# Altium project RK3588底板.PrjPcb (part 3 of 5)

## Sheet 6.音频_FAN_ADC_LED.SchDoc
size 420 x 297 mm; SheetNumber: 6; SheetTotal: 13
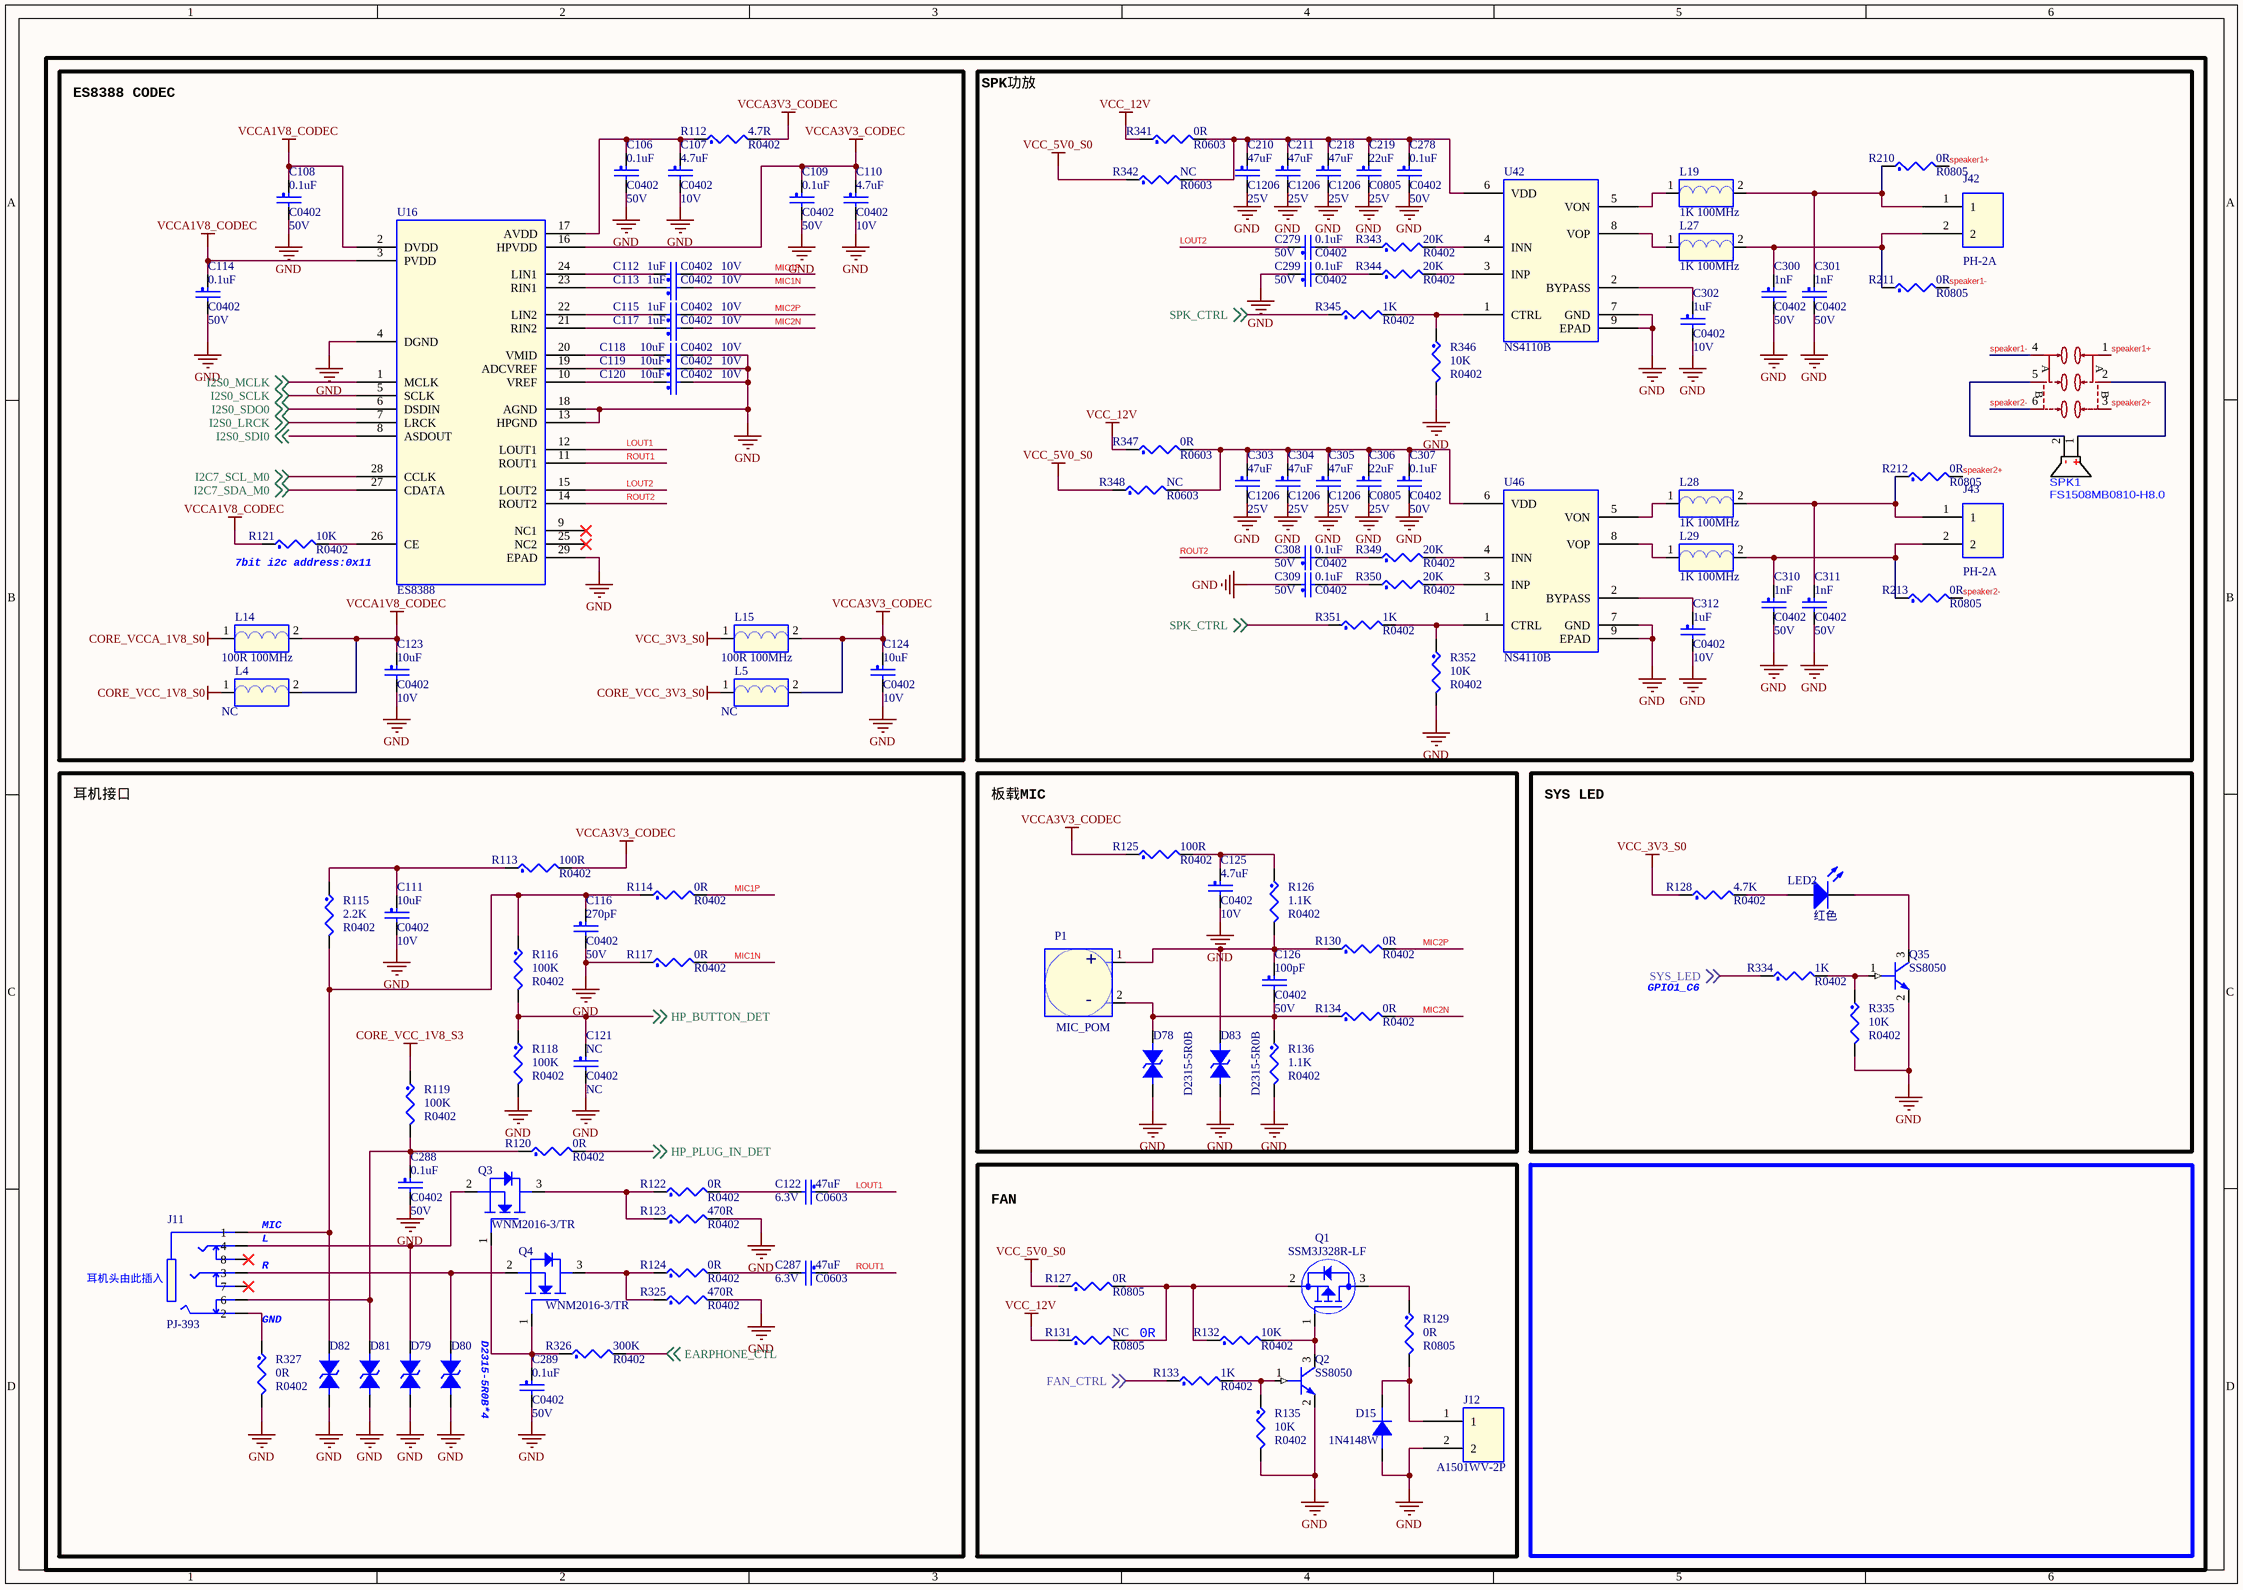
[diagram p5: 6.音频_FAN_ADC_LED.SchDoc]

### Parts
C106  0.1uF  Voltage: 50V  [C0402]
C107  4.7uF  Voltage: 10V  [C0402]
C108  0.1uF  Voltage: 50V  [C0402]
C109  0.1uF  Voltage: 50V  [C0402]
C110  4.7uF  Voltage: 10V  [C0402]
C111  10uF  Voltage: 10V  [C0402]
C112  1uF  Voltage: 10V  [C0402]
C113  1uF  Voltage: 10V  [C0402]
C114  0.1uF  Voltage: 50V  [C0402]
C115  1uF  Voltage: 10V  [C0402]
C116  270pF  Voltage: 50V  [C0402]
C117  1uF  Voltage: 10V  [C0402]
C118  10uF  Voltage: 10V  [C0402]
C119  10uF  Voltage: 10V  [C0402]
C120  10uF  Voltage: 10V  [C0402]
C121  NC  [C0402]
C122  47uF  Voltage: 6.3V  [C0603]
C123  10uF  Voltage: 10V  [C0402]
C124  10uF  Voltage: 10V  [C0402]
C125  4.7uF  Voltage: 10V  [C0402]
C126  100pF  Voltage: 50V  [C0402]
C210  47uF  Voltage: 25V  [C1206]
C211  47uF  Voltage: 25V  [C1206]
C218  47uF  Voltage: 25V  [C1206]
C219  22uF  Voltage: 25V  [C0805]
C278  0.1uF  Voltage: 50V  [C0402]
C279  0.1uF  Voltage: 50V  [C0402]
C287  47uF  Voltage: 6.3V  [C0603]
C288  0.1uF  Voltage: 50V  [C0402]
C289  0.1uF  Voltage: 50V  [C0402]
C299  0.1uF  Voltage: 50V  [C0402]
C300  1nF  Voltage: 50V  [C0402]
C301  1nF  Voltage: 50V  [C0402]
C302  1uF  Voltage: 10V  [C0402]
C303  47uF  Voltage: 25V  [C1206]
C304  47uF  Voltage: 25V  [C1206]
C305  47uF  Voltage: 25V  [C1206]
C306  22uF  Voltage: 25V  [C0805]
C307  0.1uF  Voltage: 50V  [C0402]
C308  0.1uF  Voltage: 50V  [C0402]
C309  0.1uF  Voltage: 50V  [C0402]
C310  1nF  Voltage: 50V  [C0402]
C311  1nF  Voltage: 50V  [C0402]
C312  1uF  Voltage: 10V  [C0402]
D15  1N4148W  [SOD-123]
D78  D2315-5R0B  [esd0402]
D79  D2315-5R0B  [esd0402]  (value not drawn)
D80  D2315-5R0B  [esd0402]  (value not drawn)
D81  D2315-5R0B  [esd0402]  (value not drawn)
D82  D2315-5R0B  [esd0402]  (value not drawn)
D83  D2315-5R0B  [esd0402]
J11  PJ-393  [audio_smd_7p_6r0x8r8]
J12  A1501WV-2P  [zh1p5mm_th_2p]
J42  PH-2A  [PH-1x2-2P0_l]
J43  PH-2A  [PH-1x2-2P0_l]
L4  NC  [L0603]
L5  NC  [L0603]
L14  100R 100MHz  [L0603]
L15  100R 100MHz  [L0603]
L19  1K 100MHz  [L0603]
L27  1K 100MHz  [L0603]
L28  1K 100MHz  [L0603]
L29  1K 100MHz  [L0603]
LED2  红色  [LED0603_R]
P1  MIC_POM  [MIC2-4R00-TM]
Q1  SSM3J328R-LF  [SOT23]
Q2  SS8050  [SOT23]
Q3  WNM2016-3/TR  [SOT23]
Q4  WNM2016-3/TR  [SOT23]
Q35  SS8050  [SOT23]
R112  4.7R  [R0402]
R113  100R  [R0402]
R114  0R  [R0402]
R115  2.2K  [R0402]
R116  100K  [R0402]
R117  0R  [R0402]
R118  100K  [R0402]
R119  100K  [R0402]
R120  0R  [R0402]
R121  10K  [R0402]
R122  0R  [R0402]
R123  470R  [R0402]
R124  0R  [R0402]
R125  100R  [R0402]
R126  1.1K  [R0402]
R127  0R  [R0805]
R128  4.7K  [R0402]
R129  0R  [R0805]
R130  0R  [R0402]
R131  NC  [R0805]
R132  10K  [R0402]
R133  1K  [R0402]
R134  0R  [R0402]
R135  10K  [R0402]
R136  1.1K  [R0402]
R210  0R  [R0805]
R211  0R  [R0805]
R212  0R  [R0805]
R213  0R  [R0805]
R325  470R  [R0402]
R326  300K  [R0402]
R327  0R  [R0402]
R334  1K  [R0402]
R335  10K  [R0402]
R341  0R  [R0603]
R342  NC  [R0603]
R343  20K  [R0402]
R344  20K  [R0402]
R345  1K  [R0402]
R346  10K  [R0402]
R347  0R  [R0603]
R348  NC  [R0603]
R349  20K  [R0402]
R350  20K  [R0402]
R351  1K  [R0402]
R352  10K  [R0402]
SPK1  FS1508MB0810-H8.0  [BEEP-TH_BD15.0-P10.20-D1.2]
SW5  MST22D18G2  [SW-SMD_MST22D18G2]  (value not drawn)
U16  ES8388  [qfn28_0r45-4x4EP2R6X2R6]
U42  NS4110B  [SOP-8-EP-2R5X3R4]
U46  NS4110B  [SOP-8-EP-2R5X3R4]

### Blocks framed on the sheet
ES8388 CODEC: C106-C110 C112-C115 C117-C120 C123 C124 L4 L5 L14 L15 R112 R121 U16
SPK功放: C210 C211 C218 C219 C278 C279 C299-C312 J42 J43 L19 L27-L29 R210-R213 R341-R352 SPK1 SW5 U42 U46
耳机接口: C111 C116 C121 C122 C287-C289 D79-D82 J11 Q3 Q4 R113-R120 R122-R124 R325-R327
板载MIC: C125 C126 D78 D83 P1 R125 R126 R130 R134 R136
SYS LED: LED2 Q35 R128 R334 R335
FAN: D15 J12 Q1 Q2 R127 R129 R131-R133 R135

### Nets
CORE_VCC_1V8_S0: L4.1
CORE_VCC_1V8_S3: R119.1
CORE_VCC_3V3_S0: L5.1
CORE_VCCA_1V8_S0: L14.1
GND: C106.2 C107.2 C108.2 C109.2 C110.2 C111.2 C114.2 C116.2 C118.2 C119.2 C120.2 C121.2 C123.2 C124.2 C125.2 C210.2 C211.2 C218.2 C219.2 C278.2 C288.2 C289.2 C299.1 C300.2 C301.2 C302.2 C303.2 C304.2 C305.2 C306.2 C307.2 C309.1 C310.2 C311.2 C312.2 D15.2(A) D78.1 D79.1 D80.1 D81.1 D82.1 D83.1 J12.2 Q2.2(EMITTER) Q35.2(EMITTER) R117.1 R118.2 R123.2 R135.2 R136.2 R325.2 R327.2 R335.2 R346.2 R352.2 U16.4(DGND) U16.13(HPGND) U16.18(AGND) U16.29(EPAD) U42.7(GND) U42.9(EPAD) U46.7(GND) U46.9(EPAD)
VCC_3V3_S0: L15.1 R128.1
VCC_5V0_S0: R127.1 R342.1 R348.1
VCC_12V: R131.1 R341.1 R347.1
VCCA1V8_CODEC: C108.1 C114.1 C123.1 L4.2 L14.2 R121.1 U16.2(DVDD) U16.3(PVDD)
VCCA3V3_CODEC: C109.1 C110.1 C124.1 L5.2 L15.2 R112.2 R113.2 R125.1 U16.16(HPVDD)
EARPHONE_CTL: R326.2 ; off-sheet EARPHONE_CTL
FAN_CTRL: R133.1 ; off-sheet FAN_CTRL
HP_BUTTON_DET: C121.1 R116.2 R118.1 ; off-sheet HP_BUTTON_DET
HP_PLUG_IN_DET: R120.2 ; off-sheet HP_PLUG_IN_DET  [project net GPIO0_A0]
I2C7_SCL_M0: U16.28(CCLK) ; off-sheet I2C7_SCL_M0
I2C7_SDA_M0: U16.27(CDATA) ; off-sheet I2C7_SDA_M0
I2S0_LRCK: U16.7(LRCK) ; off-sheet I2S0_LRCK
I2S0_MCLK: U16.1(MCLK) ; off-sheet I2S0_MCLK
I2S0_SCLK: U16.5(SCLK) ; off-sheet I2S0_SCLK
I2S0_SDI0: U16.8(ASDOUT) ; off-sheet I2S0_SDI0
I2S0_SDO0: U16.6(DSDIN) ; off-sheet I2S0_SDO0
LOUT1: C122.1 U16.12(LOUT1)
LOUT2: C279.1 U16.15(LOUT2)
MIC1N: C113.2 R117.2
MIC1P: C112.2 R114.2
MIC2N: C117.2 R134.2
MIC2P: C115.2 R130.2
ROUT1: C287.1 U16.11(ROUT1)
ROUT2: C308.1 U16.14(ROUT2)
speaker1+: R210.2 SW5.1
speaker1-: R211.2 SW5.4
speaker2+: R212.2 SW5.3
speaker2-: R213.2 SW5.6
SPK_CTRL: R345.1 R351.1 ; off-sheet SPK_CTRL  [project net GPIO3_D5]
SYS_LED: R334.1 ; off-sheet SYS_LED  [project net GPIO1_C6]
NetC106_1: C106.1 C107.1 R112.1 U16.17(AVDD)
NetC111_1: C111.1 R113.1 R115.1
NetC112_1: C112.1 U16.24(LIN1)
NetC113_1: C113.1 U16.23(RIN1)
NetC115_1: C115.1 U16.22(LIN2)
NetC116_1: C116.1 D82.2 J11.1 R114.1 R115.2 R116.1
NetC117_1: C117.1 U16.21(RIN2)
NetC118_1: C118.1 U16.20(VMID)
NetC119_1: C119.1 U16.19(ADCVREF)
NetC120_1: C120.1 U16.10(VREF)
NetC122_2: C122.2 R122.2
NetC125_1: C125.1 R125.2 R126.1
NetC126_1: C126.1 D83.2 P1.1(Out) R126.2 R130.1
NetC126_2: C126.2 D78.2 P1.2(GND) R134.1 R136.1
NetC210_1: C210.1 C211.1 C218.1 C219.1 C278.1 R341.2 R342.2 U42.6(VDD)
NetC279_2: C279.2 R343.1
NetC287_2: C287.2 R124.2
NetC288_1: C288.1 D81.2 J11.6 R119.2 R120.1
NetC289_1: C289.1 Q3.1(GATE) Q4.1(GATE) R326.1
NetC299_2: C299.2 R344.1
NetC300_1: C300.1 J42.2 L27.2 R211.1
NetC301_1: C301.1 J42.1 L19.2 R210.1
NetC302_1: C302.1 U42.2(BYPASS)
NetC303_1: C303.1 C304.1 C305.1 C306.1 C307.1 R347.2 R348.2 U46.6(VDD)
NetC308_2: C308.2 R349.1
NetC309_2: C309.2 R350.1
NetC310_1: C310.1 J43.2 L29.2 R213.1
NetC311_1: C311.1 J43.1 L28.2 R212.1
NetC312_1: C312.1 U46.2(BYPASS)
NetD15_1: D15.1(K) J12.1 R129.2
NetD79_2: D79.2 J11.4 Q3.2(SOURCE)
NetD80_2: D80.2 J11.3 Q4.2(SOURCE)
NetJ11_2: J11.2 R327.1
NetL19_1: L19.1 U42.5(VON)
NetL27_1: L27.1 U42.8(VOP)
NetL28_1: L28.1 U46.5(VON)
NetL29_1: L29.1 U46.8(VOP)
NetLED2_1: LED2.1(A) R128.2
NetLED2_2: LED2.2(K) Q35.3(COLLECTOR)
NetQ1_1: Q1.1(GATE) Q2.3(COLLECTOR) R132.2
NetQ1_2: Q1.2(SOURCE) R127.2 R131.2 R132.1
NetQ1_3: Q1.3(DRAIN) R129.1
NetQ2_1: Q2.1(BASE) R133.2 R135.1
NetQ3_3: Q3.3(DRAIN) R122.1 R123.1
NetQ4_3: Q4.3(DRAIN) R124.1 R325.1
NetQ35_1: Q35.1(BASE) R334.2 R335.1
NetR121_2: R121.2 U16.26(CE)
NetR343_2: R343.2 U42.4(INN)
NetR344_2: R344.2 U42.3(INP)
NetR345_2: R345.2 R346.1 U42.1(CTRL)
NetR349_2: R349.2 U46.4(INN)
NetR350_2: R350.2 U46.3(INP)
NetR351_2: R351.2 R352.1 U46.1(CTRL)
NetSPK1_1: SPK1.1 SW5.2
NetSPK1_2: SPK1.2 SW5.5

Not connected (* = marked no-connect by the designer): J11 7* 8*; U16 9(NC1)* 25(NC2)*

### Notes on the sheet
- (near R121) 7bit i2c address:0x11
- GPIO1_C6
- (near J11) MIC
- (near J11) R
- (near J11) L
- 耳机头由此插入
- GND
- D2315-5R0B*4
- (near R131) 0R
- (in symbol MIC_POM) +; -
- (in symbol MST22D18G2) A; B

### Library data of the parts
C106 C108 C109 C114 C289 C299 C307 C308 = CAP_NP: CLASS: DISCRETE; 规格: 贴片电容0.1uF 10% 50V X5R 0402; 规格编号: 0402X104K500NT; 条码: EBF29060118; 品牌: 风华; 类别: 贴片电容0402; 规格书: 风华电容.pdf; 价格: 0.029826; 生命周期: 量产; PCB Footprint: C0402
C107 C110 = CAP_NP: CLASS: DISCRETE; 生命周期: 量产; 价格: 0.059058; 规格书: 国巨-贴片电容.pdf; 类别: 贴片电容0402; 品牌: 国巨; 条码: EBF29060248; 规格编号: CC0402KRX5R6BB475; 规格: 贴片电容4.7uF 10% 10V X5R 0402; PCB Footprint: C0402
C111 C118-C120 = CAP_NP: CLASS: DISCRETE; 规格: 贴片电容10uF 20% 10V X5R 0402; 规格编号: CL05A106MP8NUB8; 条码: EBF29060247; 品牌: 三星; 类别: 贴片电容0402; 规格书: 三星电容.pdf; 价格: 0.518415; 生命周期: 量产; PCB Footprint: C0402
C112 C113 C115 C117 C312 = CAP_NP: CLASS: DISCRETE; 生命周期: 量产; 价格: 0.01191; 规格书: 风华电容.pdf; 类别: 贴片电容0402; 品牌: 风华; 条码: EBF29060121; 规格编号: 0402X105K100NT; 规格: 贴片电容1uF 10% 10V X5R 0402; PCB Footprint: C0402
C116 = CAP_NP: CLASS: DISCRETE; 规格: 贴片电容270pF 5% 50V C0G 0402; 规格编号: 0402CG271J500NT; 条码: EBF29060290; 品牌: 风华; 类别: 贴片电容0402; 规格书: 风华电容.pdf; 价格: 0.018204; 生命周期: 量产; PCB Footprint: C0402
C121 = CAP_NP: CLASS: DISCRETE; 规格: 贴片电容NC 预留; 条码: EBF29060149; 类别: 贴片电容0402; Voltage: NC; PCB Footprint: C0402
C122 C287 = CAP_NP: CLASS: DISCRETE; 规格: 贴片电容47uF 20% 6.3V X5R 0603; 规格编号: CL10A476MQ8QRNC; 条码: EBF29060263; 品牌: 三星; 类别: 贴片电容0603; 规格书: 三星电容.pdf; 价格: 0.420524; 生命周期: 量产; PCB Footprint: C0603
C123 C124 = CAP_NP: CLASS: DISCRETE; 生命周期: 量产; 价格: 0.518415; 规格书: 三星电容.pdf; 类别: 贴片电容0402; 品牌: 三星; 条码: EBF29060247; 规格编号: CL05A106MP8NUB8; 规格: 贴片电容10uF 20% 10V X5R 0402; PCB Footprint: C0402
C125 = CAP_NP: CLASS: DISCRETE; 规格: 贴片电容4.7uF 10% 10V X5R 0402; 规格编号: CC0402KRX5R6BB475; 条码: EBF29060248; 品牌: 国巨; 类别: 贴片电容0402; 规格书: 国巨-贴片电容.pdf; 价格: 0.059058; 生命周期: 量产; PCB Footprint: C0402
C126 = CAP_NP: CLASS: DISCRETE; 生命周期: 量产; 价格: 0.034837; 规格书: 村田040系列贴片电容.pdf; 类别: 贴片电容0402; 品牌: 村田; 条码: EBF29060302; 规格编号: GRT1555C1H101JA; 规格: 贴片电容100pF 5% 50V C0G 0402; PCB Footprint: C0402
C210 C211 C218 = CAP_NP: CLASS: DISCRETE; 规格: 贴片电容47uF 20% 25V X5R 1206; 规格编号: GRM31CR61E476ME44L; 条码: EBF29060192; 品牌: 村田; 类别: 贴片电容1206; 规格书: 村田贴片电容.pdf; 价格: 1.12; 生命周期: 量产; PCB Footprint: C1206
C219 C306 = CAP_NP: CLASS: DISCRETE; 规格: 贴片电容22uF 20% 25V X5R 0805; 规格编号: 0805X226M250NT; 条码: EBF29060173; 品牌: 风华; 类别: 贴片电容0805; 规格书: 风华电容.pdf; 价格: 0.285631; 生命周期: 量产; PCB Footprint: C0805
C278 C279 C288 C309 = CAP_NP: CLASS: DISCRETE; 生命周期: 量产; 价格: 0.029826; 规格书: 风华电容.pdf; 类别: 贴片电容0402; 品牌: 风华; 条码: EBF29060118; 规格编号: 0402X104K500NT; 规格: 贴片电容0.1uF 10% 50V X5R 0402; PCB Footprint: C0402
C300 C301 = CAP_NP: CLASS: DISCRETE; 规格: 贴片电容1nF 20% 50V X7R 0402; 规格编号: 0402B102M500NT; 条码: EBF29060175; 品牌: 风华; 类别: 贴片电容0402; 规格书: 风华电容.pdf; 价格: 0.006195; 生命周期: 量产; PCB Footprint: C0402
C302 = CAP_NP: CLASS: DISCRETE; 规格: 贴片电容1uF 10% 10V X5R 0402; 规格编号: 0402X105K100NT; 条码: EBF29060121; 品牌: 风华; 类别: 贴片电容0402; 规格书: 风华电容.pdf; 价格: 0.01191; 生命周期: 量产; PCB Footprint: C0402
C303-C305 = CAP_NP: CLASS: DISCRETE; 生命周期: 量产; 价格: 1.12; 规格书: 村田贴片电容.pdf; 类别: 贴片电容1206; 品牌: 村田; 条码: EBF29060192; 规格编号: GRM31CR61E476ME44L; 规格: 贴片电容47uF 20% 25V X5R 1206; PCB Footprint: C1206
C310 C311 = CAP_NP: CLASS: DISCRETE; 生命周期: 量产; 价格: 0.006195; 规格书: 风华电容.pdf; 类别: 贴片电容0402; 品牌: 风华; 条码: EBF29060175; 规格编号: 0402B102M500NT; 规格: 贴片电容1nF 20% 50V X7R 0402; PCB Footprint: C0402
D15 = DIODE: 丝印: T4; 生命周期: 量产; 价格: 0.061637; 规格书: 1N4148WT4.pdf; 类别: 贴片开关二极管; 品牌: 江苏长电; 条码: EBF29140015; 规格: 开关二极管 反向耐压值100V 平均整流电流150mA 正向压降1.25V 150mA 功率500mW; 规格编号: 1N4148W; PCB Footprint: SOD-123
D78 D80 D83 = DIODE BI-DIR TRIG: 规格: 防静电保护ESD二极管 反向工作电压5V 击穿电压7V 钳位电压10.5V 结电容Cj 0.3pF; 条码: EBFCIS240517170922; 品牌: 千虹; 类别: 贴片ESD; 规格书: 千虹_D2315-5R0B.pdf; 生命周期: 量产; 备注: 通用; PCB Footprint: esd0402; 规格编号: D2315-5R0B
D79 D81 D82 = DIODE BI-DIR TRIG: 备注: 通用; 生命周期: 量产; 规格书: 千虹_D2315-5R0B.pdf; 类别: 贴片ESD; 品牌: 千虹; 条码: EBFCIS240517170922; 规格: 防静电保护ESD二极管 反向工作电压5V 击穿电压7V 钳位电压10.5V 结电容Cj 0.3pF; PCB Footprint: esd0402; 规格编号: D2315-5R0B
J11 = PJ-393: 规格: PJ-393_3.5MM四段式耳机插座_7pin; 条码: EBF29040116; 类别: 耳机座; 规格书: PJ-393_3.5MM四段式耳机插座_7pin.pdf; 生命周期: 量产; 品牌: 品赞; PCB Footprint: audio_smd_7p_6r0x8r8; 规格编号: PJ-393
J12 = 1X2PIN: 生命周期: 量产; 规格书: 长江连接器_A1501WV-2P.PDF; 类别: 线对板连接器; 品牌: 长江连接器; 条码: EBF29040095; 规格: ZH1.5直插 镀锡 2P 针座连接器; PCB Footprint: zh1p5mm_th_2p; 规格编号: A1501WV-2P
J42 J43 = 1X2PIN: 可替代料: EBF29040005; 生命周期: 量产; 价格: 0.019031; 规格书: 博穆精密_PH2.0-A.pdf; 类别: PH连接器; 品牌: 博穆精密; 规格: 直针PH2.0-2P 间距2.0MM 拔插式 接插件; PCB Footprint: PH-1x2-2P0_l; 条码: EBF29040005; 规格编号: PH-2A
L4 L5 L14 = BEAD: CLASS: DISCRETE; 生命周期: 量产; 价格: 0.021567; 规格书: 顺络-磁珠.pdf; 类别: 贴片磁珠0603; 品牌: 顺络; 条码: EBF29050038; 规格编号: UPZ1608E101-3R0TF; 规格: 磁珠100Ω @100MHz 额定电流3A 直流电阻30mΩ; PCB Footprint: L0603
L15 = BEAD: CLASS: DISCRETE; 规格: 磁珠100Ω @100MHz 额定电流3A 直流电阻30mΩ; 规格编号: UPZ1608E101-3R0TF; 条码: EBF29050038; 品牌: 顺络; 类别: 贴片磁珠0603; 规格书: 顺络-磁珠.pdf; 价格: 0.021567; 生命周期: 量产; PCB Footprint: L0603
L19 L27 = BEAD: CLASS: DISCRETE; 规格: 磁珠1K@100MHz额定电流600mA直流电阻350mΩ; 规格编号: BLM18HE102SN1D; 条码: EBFCIS230428095012; 品牌: 村田; 类别: 贴片磁珠0603; 规格书: 村田_BLM18H_SN系列磁珠.pdf; 价格: 0.149038; 生命周期: 量产; 备注: RK3566广告机; PCB Footprint: L0603
L28 L29 = BEAD: CLASS: DISCRETE; 生命周期: 量产; 价格: 0.149038; 规格书: 村田_BLM18H_SN系列磁珠.pdf; 类别: 贴片磁珠0603; 品牌: 村田; 条码: EBFCIS230428095012; 规格编号: BLM18HE102SN1D; 规格: 磁珠1K@100MHz额定电流600mA直流电阻350mΩ; 备注: RK3566广告机; PCB Footprint: L0603
LED2 = LED: 贴片LED; 封装库来自淘宝卖家：黄晶宝石: 其他店铺购入均为盗版封装库，无更新权益，请立即申请退款，本店现金奖励200~1000元; BOM名称: 贴片LED
P1 = MIC_POM: CLASS: IC; 规格: 4*1.2mm咪头 双电容驻极体话筒 拾音器 工作电压1.5V-10V 灵敏度-62DB 低阻抗; 规格编号: GMI4015P-2C-62db; 条码: EBFCIS221130183008; 品牌: 赢海; 类别: 麦克风; 规格书: 赢海_GMI4015P-2C-62db.pdf; 价格: 0.868384; 生命周期: 量产; PCB Footprint: MIC2-4R00-TM
Q1 = MOSFET_P: CLASS: IC; 规格: P沟道MOS 导通电阻29.8mΩ 电流3A 1.5V可驱动; 规格编号: SSM3J328R LF; 条码: EBF29280008; 品牌: 东芝; 类别: P-MOS; 规格书: SSM3J328R-LF.pdf; 价格: 0.447836; 生命周期: 量产; 丝印: KFH-XXX; PCB Footprint: SOT23
Q2 Q35 = NPN: CLASS: IC; 规格: 贴片三极管SS8050 集电极电流1.5A 额定功率300mW NPN; 条码: EBF29090001; 品牌: 江苏长电; 类别: 贴片三极管SOT-23; 规格书: 江苏长电-SS8050Y1.pdf; 价格: 0.086744; 生命周期: 量产; 丝印: Y1; 规格编号: SS8050; PCB Footprint: SOT23
Q3 = MOSFET N: 规格: N沟道MOS 导通电阻47mΩ 电流3.6A 4.5V 阈值电压(Vgs(th)@Id)1V 连续漏极电流2.9A; 条码: EBF29280014; 品牌: 韦尔; 类别: N-MOS; 规格书: WNM2016-3_TR.pdf; 备注: 立创停售; PCB Footprint: SOT23; 规格编号: WNM2016-3/TR
Q4 = MOSFET N: 备注: 立创停售; 规格书: WNM2016-3_TR.pdf; 类别: N-MOS; 品牌: 韦尔; 条码: EBF29280014; 规格: N沟道MOS 导通电阻47mΩ 电流3.6A 4.5V 阈值电压(Vgs(th)@Id)1V 连续漏极电流2.9A; PCB Footprint: SOT23; 规格编号: WNM2016-3/TR
R112 = RES: CLASS: DISCRETE; 规格: 贴片电阻4.7R 1% 1/16W 0402; 规格编号: 0402WGF470KTCE; 条码: EBFCIS221112135607; 品牌: 厚声; 类别: 贴片电阻0402; 规格书: 厚声-无铅厚膜电阻.pdf; 价格: 0.003317; 生命周期: 量产; PCB Footprint: R0402
R113 = RES: CLASS: DISCRETE; 规格: 贴片电阻100R 1% 1/16W 0402; 规格编号: RI0402L1000FT; 条码: EBF29070053; 品牌: 合科泰; 类别: 贴片电阻0402; 规格书: 合科泰-RI系列电阻.pdf; 生命周期: 量产; PCB Footprint: R0402
R114 R117 R120 R122 R124 R130 R327 = RES: CLASS: DISCRETE; 生命周期: 量产; 规格书: 合科泰-RI系列电阻.pdf; 类别: 贴片电阻0402; 品牌: 合科泰; 条码: EBF29070049; 规格编号: RI0402L000FT; 规格: 贴片电阻0R 1% 1/16W 0402; PCB Footprint: R0402
R115 = RES: CLASS: DISCRETE; 规格: 贴片电阻2.2K 1% 1/16W 0402; 规格编号: RI0402L2201FT; 条码: EBF29070051; 品牌: 合科泰; 类别: 贴片电阻0402; 规格书: 合科泰-RI系列电阻.pdf; 生命周期: 量产; PCB Footprint: R0402
R116 R118 = RES: CLASS: DISCRETE; 生命周期: 量产; 规格书: 合科泰-RI系列电阻.pdf; 类别: 贴片电阻0402; 品牌: 合科泰; 条码: EBF29070054; 规格编号: RI0402L1003FT; 规格: 贴片电阻100K 1% 1/16W 0402; PCB Footprint: R0402
R119 = RES: CLASS: DISCRETE; 规格: 贴片电阻100K 1% 1/16W 0402; 规格编号: RI0402L1003FT; 条码: EBF29070054; 品牌: 合科泰; 类别: 贴片电阻0402; 规格书: 合科泰-RI系列电阻.pdf; 生命周期: 量产; PCB Footprint: R0402
R121 R346 = RES: CLASS: DISCRETE; 生命周期: 量产; 价格: 0.002773; 规格书: 厚声-无铅厚膜电阻.pdf; 类别: 贴片电阻0402; 品牌: 厚声; 条码: EBF29070046; 规格编号: 0402WGF1002TCE; 规格: 贴片电阻10K 1% 1/16W 0402; PCB Footprint: R0402
R123 R325 = RES: CLASS: DISCRETE; 规格: 贴片电阻470R 1% 1/16W 0402; 规格编号: 0402WGF4700TCE; 条码: EBF29070284; 品牌: 厚声; 类别: 贴片电阻0402; 规格书: 厚声-无铅厚膜电阻.pdf; 价格: 0.002728; 生命周期: 量产; PCB Footprint: R0402
R125 = RES: CLASS: DISCRETE; 生命周期: 量产; 规格书: 合科泰-RI系列电阻.pdf; 类别: 贴片电阻0402; 品牌: 合科泰; 条码: EBF29070053; 规格编号: RI0402L1000FT; 规格: 贴片电阻100R 1% 1/16W 0402; PCB Footprint: R0402
R126 R136 = RES: CLASS: DISCRETE; 规格: 贴片电阻1.1K 1% 1/16W 0402; 规格编号: 0402WGF1101TCE; 条码: EBFCIS221112135212; 品牌: 厚声; 类别: 贴片电阻0402; 规格书: 厚声-无铅厚膜电阻.pdf; 价格: 0.001622; 生命周期: 量产; PCB Footprint: R0402
R127 R210-R213 = RES: CLASS: DISCRETE; 生命周期: 量产; 规格书: 合科泰-RI系列电阻.pdf; 类别: 贴片电阻0805; 品牌: 合科泰; 条码: EBF29070064; 规格编号: RI0805L0000FT; 规格: 贴片电阻0R 1% 1/8W 0805; PCB Footprint: R0805
R128 = RES: CLASS: DISCRETE; 生命周期: 量产; 规格书: 合科泰-RI系列电阻.pdf; 类别: 贴片电阻0402; 品牌: 合科泰; 条码: EBF29070047; 规格编号: RI0402L4701FT; 规格: 贴片电阻4.7K 1% 1/16W 0402; PCB Footprint: R0402
R129 = RES: CLASS: DISCRETE; 规格: 贴片电阻0R 1% 1/8W 0805; 规格编号: RI0805L0000FT; 条码: EBF29070064; 品牌: 合科泰; 类别: 贴片电阻0805; 规格书: 合科泰-RI系列电阻.pdf; 生命周期: 量产; PCB Footprint: R0805
R131 = RES: CLASS: DISCRETE; 类别: 贴片电阻0805; 条码: EBF29070089; 规格: 贴片电阻NC 预留; PCB Footprint: R0805
R132 R135 R335 R352 = RES: CLASS: DISCRETE; 规格: 贴片电阻10K 1% 1/16W 0402; 规格编号: 0402WGF1002TCE; 条码: EBF29070046; 品牌: 厚声; 类别: 贴片电阻0402; 规格书: 厚声-无铅厚膜电阻.pdf; 价格: 0.002773; 生命周期: 量产; PCB Footprint: R0402
R133 R334 R345 = RES: CLASS: DISCRETE; 生命周期: 量产; 规格书: 合科泰-RI系列电阻.pdf; 类别: 贴片电阻0402; 品牌: 合科泰; 条码: EBF29070050; 规格编号: RI0402L1001FT; 规格: 贴片电阻1K 1% 1/16W 0402; PCB Footprint: R0402
R134 = RES: CLASS: DISCRETE; 规格: 贴片电阻0R 1% 1/16W 0402; 规格编号: RI0402L000FT; 条码: EBF29070049; 品牌: 合科泰; 类别: 贴片电阻0402; 规格书: 合科泰-RI系列电阻.pdf; 生命周期: 量产; PCB Footprint: R0402
R326 = RES: CLASS: DISCRETE; 规格: 贴片电阻300K 1% 1/16W 0402; 规格编号: RI0402L3003FT; 条码: EBF29070220; 品牌: 合科泰; 类别: 贴片电阻0402; 规格书: 合科泰-RI系列电阻.pdf; 生命周期: 量产; PCB Footprint: R0402
R341 R347 = RES: CLASS: DISCRETE; 生命周期: 量产; 规格书: 合科泰-RI系列电阻.pdf; 类别: 贴片电阻0603; 品牌: 合科泰; 条码: EBF29070063; 规格编号: RI0603L0000FT; 规格: 贴片电阻0R 1% 1/10W 0603; PCB Footprint: R0603
R342 R348 = RES: CLASS: DISCRETE; 类别: 贴片电阻0603; 条码: EBF29070088; 规格: 贴片电阻NC 预留; PCB Footprint: R0603
R343 R344 = RES: CLASS: DISCRETE; 规格: 贴片电阻20K 1% 1/16W 0402; 规格编号: 0402WGF2002TCE; 条码: EBF29070223; 品牌: 厚声; 类别: 贴片电阻0402; 规格书: 厚声-无铅厚膜电阻.pdf; 价格: 0.002473; 生命周期: 量产; PCB Footprint: R0402
R349 R350 = RES: CLASS: DISCRETE; 生命周期: 量产; 价格: 0.002473; 规格书: 厚声-无铅厚膜电阻.pdf; 类别: 贴片电阻0402; 品牌: 厚声; 条码: EBF29070223; 规格编号: 0402WGF2002TCE; 规格: 贴片电阻20K 1% 1/16W 0402; PCB Footprint: R0402
R351 = RES: CLASS: DISCRETE; 规格: 贴片电阻1K 1% 1/16W 0402; 规格编号: RI0402L1001FT; 条码: EBF29070050; 品牌: 合科泰; 类别: 贴片电阻0402; 规格书: 合科泰-RI系列电阻.pdf; 生命周期: 量产; PCB Footprint: R0402
SW5 = MST22D18G2: Manufacturer: SHOU HAN(首韩); Add into BOM: yes; Symbol: MST22D18G2; Device: MST22D18G2; LCSC Part Name: 两档立式贴片 6脚拨动 柄长2.0MM; Supplier Part: C431544; Manufacturer Part: MST22D18G2; Supplier Footprint: SMD,3.6x9.1mm; JLCPCB Part Class: 扩展库; Datasheet: https://atta.szlcsc.com/upload/public/pdf/source/20190925/C431544_D32DFFD935A96A6C5145903882D4ABA1.pdf; Supplier: LCSC; Convert to PCB: yes
U16 = ES8388: 价格: 3.904; 规格书: 顺芯_ES8388.pdf; 类别: 音频芯片; 品牌: 顺芯; 条码: EBFCIS221116105415; 规格: 音频接口芯片 模拟供电1.7V~3.6V 核心与IO供电1.5V~3.6V; 规格编号: ES8388; PCB Footprint: qfn28_0r45-4x4EP2R6X2R6
U42 U46 = NS4110B: 规格: 单声道AB/D类音频功率放大器 工作电压:6V~14V 输出功率:18W@4Ω 超低EMI 支持差分输入; 条码: EBFCIS230518164803; 品牌: 纳芯威; 类别: 音频芯片; 规格书: 纳芯威_NS4110B音频功放.pdf; 生命周期: 量产; 备注: RK3566广告机; 规格编号: NS4110B; PCB Footprint: SOP-8-EP-2R5X3R4

## Sheet 7.HDMI2.SchDoc
size 297 x 209 mm; SheetNumber: 7; SheetTotal: 14
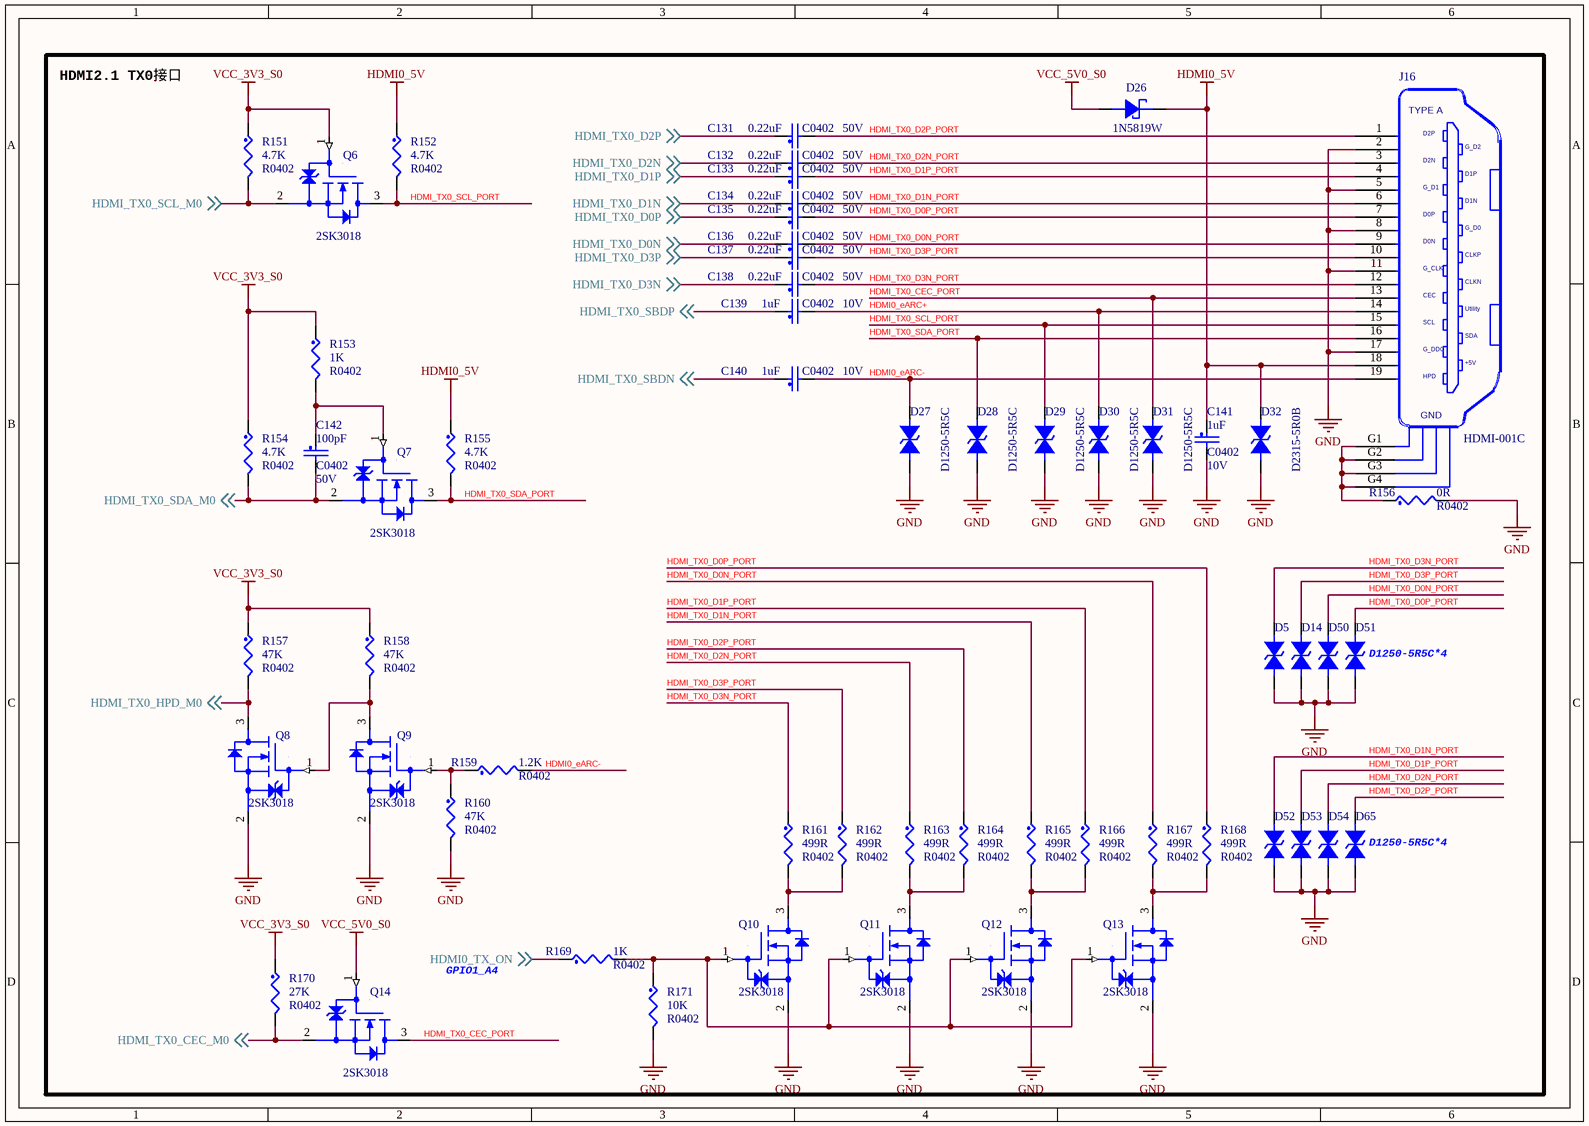
[diagram p6: 7.HDMI2.SchDoc]

### Parts
C131  0.22uF  Voltage: 50V  [C0402]
C132  0.22uF  Voltage: 50V  [C0402]
C133  0.22uF  Voltage: 50V  [C0402]
C134  0.22uF  Voltage: 50V  [C0402]
C135  0.22uF  Voltage: 50V  [C0402]
C136  0.22uF  Voltage: 50V  [C0402]
C137  0.22uF  Voltage: 50V  [C0402]
C138  0.22uF  Voltage: 50V  [C0402]
C139  1uF  Voltage: 10V  [C0402]
C140  1uF  Voltage: 10V  [C0402]
C141  1uF  Voltage: 10V  [C0402]
C142  100pF  Voltage: 50V  [C0402]
D5  D1250-5R5C  [esd0402]  (value not drawn)
D14  D1250-5R5C  [esd0402]  (value not drawn)
D26  1N5819W  [SOD-123]
D27  D1250-5R5C  [esd0402]
D28  D1250-5R5C  [esd0402]
D29  D1250-5R5C  [esd0402]
D30  D1250-5R5C  [esd0402]
D31  D1250-5R5C  [esd0402]
D32  D2315-5R0B  [esd0402]
D50  D1250-5R5C  [esd0402]  (value not drawn)
D51  D1250-5R5C  [esd0402]  (value not drawn)
D52  D1250-5R5C  [esd0402]  (value not drawn)
D53  D1250-5R5C  [esd0402]  (value not drawn)
D54  D1250-5R5C  [esd0402]  (value not drawn)
D65  D1250-5R5C  [esd0402]  (value not drawn)
J16  HDMI-001C  [HDMI-SMD]
Q6  2SK3018  [SOT23]
Q7  2SK3018  [SOT23]
Q8  2SK3018  [SOT23]
Q9  2SK3018  [SOT23]
Q10  2SK3018  [SOT23]
Q11  2SK3018  [SOT23]
Q12  2SK3018  [SOT23]
Q13  2SK3018  [SOT23]
Q14  2SK3018  [SOT23]
R151  4.7K  [R0402]
R152  4.7K  [R0402]
R153  1K  [R0402]
R154  4.7K  [R0402]
R155  4.7K  [R0402]
R156  0R  [R0402]
R157  47K  [R0402]
R158  47K  [R0402]
R159  1.2K  [R0402]
R160  47K  [R0402]
R161  499R  [R0402]
R162  499R  [R0402]
R163  499R  [R0402]
R164  499R  [R0402]
R165  499R  [R0402]
R166  499R  [R0402]
R167  499R  [R0402]
R168  499R  [R0402]
R169  1K  [R0402]
R170  27K  [R0402]
R171  10K  [R0402]

### Nets
GND: C141.2 D5.1 D14.1 D27.1 D28.1 D29.1 D30.1 D31.1 D32.1 D50.1 D51.1 D52.1 D53.1 D54.1 D65.1 J16.2 J16.5 J16.8 J16.11 J16.17 Q8.2(SOURCE) Q9.2(SOURCE) Q10.2(SOURCE) Q11.2(SOURCE) Q12.2(SOURCE) Q13.2(SOURCE) R156.2 R160.2 R171.2
HDMI0_5V: C141.1 D26.1 D32.2 J16.18 R152.1 R155.1
VCC_3V3_S0: Q6.1(GATE) R151.1 R153.1 R154.1 R157.1 R158.1 R170.1
VCC_5V0_S0: D26.2 Q14.1(GATE)
HDMI0_eARC+: C139.2 D30.2 J16.14
HDMI0_eARC-: C140.2 D27.2 J16.19 R159.2
HDMI0_TX_ON: R169.1 ; off-sheet HDMI0_TX_ON  [project net GPIO1_A4]
HDMI_TX0_CEC_M0: Q14.2(SOURCE) R170.2 ; off-sheet HDMI_TX0_CEC_M0
HDMI_TX0_CEC_PORT: D31.2 J16.13 Q14.3(DRAIN)
HDMI_TX0_D0N: C136.1 ; off-sheet HDMI_TX0_D0N
HDMI_TX0_D0N_PORT: C136.2 D50.2 J16.9 R167.1
HDMI_TX0_D0P: C135.1 ; off-sheet HDMI_TX0_D0P
HDMI_TX0_D0P_PORT: C135.2 D51.2 J16.7 R168.1
HDMI_TX0_D1N: C134.1 ; off-sheet HDMI_TX0_D1N
HDMI_TX0_D1N_PORT: C134.2 D52.2 J16.6 R165.1
HDMI_TX0_D1P: C133.1 ; off-sheet HDMI_TX0_D1P
HDMI_TX0_D1P_PORT: C133.2 D53.2 J16.4 R166.1
HDMI_TX0_D2N: C132.1 ; off-sheet HDMI_TX0_D2N
HDMI_TX0_D2N_PORT: C132.2 D54.2 J16.3 R163.1
HDMI_TX0_D2P: C131.1 ; off-sheet HDMI_TX0_D2P
HDMI_TX0_D2P_PORT: C131.2 D65.2 J16.1 R164.1
HDMI_TX0_D3N: C138.1 ; off-sheet HDMI_TX0_D3N
HDMI_TX0_D3N_PORT: C138.2 D5.2 J16.12 R161.1
HDMI_TX0_D3P: C137.1 ; off-sheet HDMI_TX0_D3P
HDMI_TX0_D3P_PORT: C137.2 D14.2 J16.10 R162.1
HDMI_TX0_HPD_M0: Q8.3(DRAIN) R157.2 ; off-sheet HDMI_TX0_HPD_M0
HDMI_TX0_SBDN: C140.1 ; off-sheet HDMI_TX0_SBDN
HDMI_TX0_SBDP: C139.1 ; off-sheet HDMI_TX0_SBDP
HDMI_TX0_SCL_M0: Q6.2(SOURCE) R151.2 ; off-sheet HDMI_TX0_SCL_M0
HDMI_TX0_SCL_PORT: D29.2 J16.15 Q6.3(DRAIN) R152.2
HDMI_TX0_SDA_M0: C142.2 Q7.2(SOURCE) R154.2 ; off-sheet HDMI_TX0_SDA_M0
HDMI_TX0_SDA_PORT: D28.2 J16.16 Q7.3(DRAIN) R155.2
NetC142_1: C142.1 Q7.1(GATE) R153.2
NetJ16_G1: J16.G1 J16.G2 J16.G3 J16.G4 R156.1
NetQ8_1: Q8.1(GATE) Q9.3(DRAIN) R158.2
NetQ9_1: Q9.1(GATE) R159.1 R160.1
NetQ10_1: Q10.1(GATE) Q11.1(GATE) Q12.1(GATE) Q13.1(GATE) R169.2 R171.1
NetQ10_3: Q10.3(DRAIN) R161.2 R162.2
NetQ11_3: Q11.3(DRAIN) R163.2 R164.2
NetQ12_3: Q12.3(DRAIN) R165.2 R166.2
NetQ13_3: Q13.3(DRAIN) R167.2 R168.2

### Notes on the sheet
- HDMI2.1 TX0接口
- (near D51) D1250-5R5C*4
- (near D65) D1250-5R5C*4
- (near Q14) GPIO1_A4
- (in symbol HDMI-001C) TYPE A; D2P; G_D2; D2N; D1P; G_D1; D1N; D0P; G_D0; D0N; CLKP; G_CLK; CLKN; CEC; Utility; SCL; SDA; G_DDC; +5V; HPD; GND

### Library data of the parts
C131-C138 = CAP_NP: CLASS: DISCRETE; 生命周期: 量产; 价格: 0.074942; 规格书: 太诱-贴片电容.pdf; 类别: 贴片电容0402; 品牌: 太诱; 条码: EBF29060266; 规格编号: UMK105BJ224MV-F; 规格: 贴片电容0.22uF 20% 50V X5R 0402; PCB Footprint: C0402
C139-C141 = CAP_NP: as C112 on sheet 6.音频_FAN_ADC_LED; PCB Footprint: C0402
C142 = CAP_NP: as C126 on sheet 6.音频_FAN_ADC_LED; PCB Footprint: C0402
D5 D14 D27-D31 D50-D54 D65 = DIODE BI-DIR TRIG: PCB Footprint: R0201; 备注: 应用于HDMI2.1; 生命周期: 量产; 规格书: 千虹_D1250-5R5C.pdf; 类别: 贴片ESD; 品牌: 千虹; 条码: EBFCIS240604160037; 规格: 防静电保护ESD二极管 反向工作电压5.5V 击穿电压6V 钳位电压10.5V 结电容Cj 0.17pF; 规格编号: D1250-5R5C
D26 = DIODE_SCHTKY: CLASS: IC; 规格: 肖特基二极管 直流反向耐压40V 平均整流电流1A 正向压降0.6V@1A SOD-123; 条码: EBF29140016; 品牌: 台湾迪嘉; 类别: 贴片肖特基二极管; 规格书: 1N5819W.pdf; 价格: 0.175675; 生命周期: 量产; 丝印: SL; PCB Footprint: SOD-123; 规格编号: 1N5819W
D32 = DIODE BI-DIR TRIG: as D79 on sheet 6.音频_FAN_ADC_LED; PCB Footprint: esd0402; 规格编号: D2315-5R0B
J16 = HDMI-001C: VPN: 1166-2C105-211; Vendor: Comtek; OriginalSymbolOrigin: (-200,650); CLASS: IO; 规格: HDMI立式; 条码: EBF29040081; 品牌: 讯普; 类别: HDMI连接器; 规格书: HDMI-001C.pdf; 生命周期: 量产; PCB Footprint: HDMI-SMD; 规格编号: HDMI-001C
Q6 Q7 Q9 = 2SK3018: CLASS: IC; 规格: N沟道MOS 导通电阻8Ω 电流10mA 0.8V可驱动; 条码: EBF29280009; 品牌: 江苏长电; 类别: N-MOS; 规格书: 长电科技-2SK3018.pdf; 价格: 0.120725; 生命周期: 量产; 丝印: KN; PCB Footprint: SOT23; 规格编号: 2SK3018
Q8 Q10-Q14 = 2SK3018: CLASS: IC; 丝印: KN; 生命周期: 量产; 价格: 0.120725; 规格书: 长电科技-2SK3018.pdf; 类别: N-MOS; 品牌: 江苏长电; 条码: EBF29280009; 规格: N沟道MOS 导通电阻8Ω 电流10mA 0.8V可驱动; PCB Footprint: SOT23; 规格编号: 2SK3018
R151 R152 R154 R155 = RES: as R128 on sheet 6.音频_FAN_ADC_LED; PCB Footprint: R0402
R153 R169 = RES: as R133 on sheet 6.音频_FAN_ADC_LED; PCB Footprint: R0402
R156 = RES: as R134 on sheet 6.音频_FAN_ADC_LED; PCB Footprint: R0402
R157 R158 = RES: CLASS: DISCRETE; 生命周期: 量产; 规格书: 厚声-无铅厚膜电阻.pdf; 类别: 贴片电阻0402; 品牌: 厚声; 条码: EBF29070247; 规格编号: 0402WGF4702TCE; 规格: 贴片电阻47K 1% 1/16W 0402; PCB Footprint: R0402
R159 = RES: CLASS: DISCRETE; 生命周期: 量产; 价格: 0.001447; 规格书: 厚声-无铅厚膜电阻.pdf; 类别: 贴片电阻0402; 品牌: 厚声; 条码: EBFCIS221112112140; 规格编号: 0402WGF1201TCE; 规格: 贴片电阻1.2K 1% 1/16W 0402; PCB Footprint: R0402
R160 = RES: CLASS: DISCRETE; 规格: 贴片电阻47K 1% 1/16W 0402; 规格编号: 0402WGF4702TCE; 条码: EBF29070247; 品牌: 厚声; 类别: 贴片电阻0402; 规格书: 厚声-无铅厚膜电阻.pdf; 生命周期: 量产; PCB Footprint: R0402
R161 R163 R166 R168 = RES: CLASS: DISCRETE; 生命周期: 量产; 价格: 0.003791; 规格书: 厚声-无铅厚膜电阻.pdf; 类别: 贴片电阻0402; 品牌: 厚声; 条码: EBF29070287; 规格编号: 0402WGF4990TCE; 规格: 贴片电阻499R 1% 1/16W 0402; PCB Footprint: R0402
R162 R164 R165 R167 = RES: CLASS: DISCRETE; 规格: 贴片电阻499R 1% 1/16W 0402; 规格编号: 0402WGF4990TCE; 条码: EBF29070287; 品牌: 厚声; 类别: 贴片电阻0402; 规格书: 厚声-无铅厚膜电阻.pdf; 价格: 0.003791; 生命周期: 量产; PCB Footprint: R0402
R170 = RES: CLASS: DISCRETE; 生命周期: 量产; 价格: 0.007054; 规格书: YAGEO国巨厚膜无铅电阻.pdf; 类别: 贴片电阻0402; 品牌: 国巨; 条码: EBF29070003; 规格编号: AC0402FR-0727KL; 规格: 贴片电阻27K 1% 1/16W 0402; PCB Footprint: R0402
R171 = RES: as R121 on sheet 6.音频_FAN_ADC_LED; PCB Footprint: R0402

## Sheet 8.HDMI2.SchDoc
size 297 x 209 mm; SheetNumber: 8; SheetTotal: 14
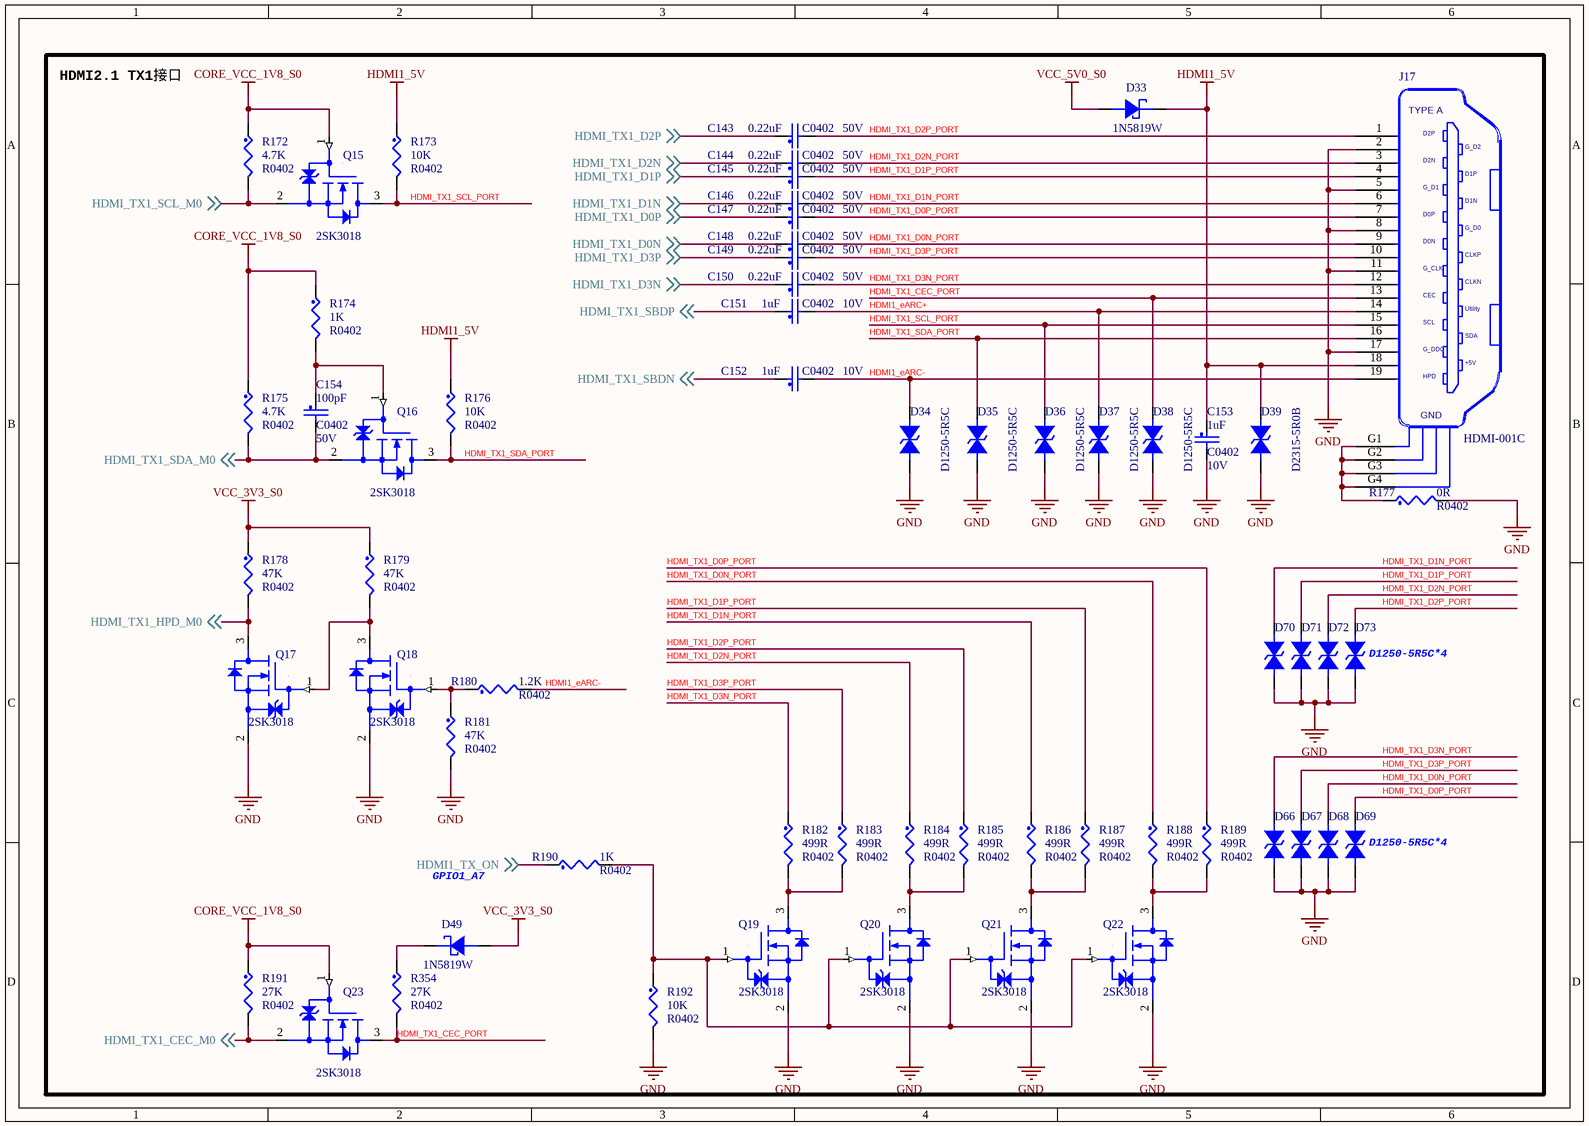
[diagram p7: 8.HDMI2.SchDoc]

### Parts
C143  0.22uF  Voltage: 50V  [C0402]
C144  0.22uF  Voltage: 50V  [C0402]
C145  0.22uF  Voltage: 50V  [C0402]
C146  0.22uF  Voltage: 50V  [C0402]
C147  0.22uF  Voltage: 50V  [C0402]
C148  0.22uF  Voltage: 50V  [C0402]
C149  0.22uF  Voltage: 50V  [C0402]
C150  0.22uF  Voltage: 50V  [C0402]
C151  1uF  Voltage: 10V  [C0402]
C152  1uF  Voltage: 10V  [C0402]
C153  1uF  Voltage: 10V  [C0402]
C154  100pF  Voltage: 50V  [C0402]
D33  1N5819W  [SOD-123]
D34  D1250-5R5C  [esd0402]
D35  D1250-5R5C  [esd0402]
D36  D1250-5R5C  [esd0402]
D37  D1250-5R5C  [esd0402]
D38  D1250-5R5C  [esd0402]
D39  D2315-5R0B  [esd0402]
D49  1N5819W  [SOD-123]
D66  D1250-5R5C  [esd0402]  (value not drawn)
D67  D1250-5R5C  [esd0402]  (value not drawn)
D68  D1250-5R5C  [esd0402]  (value not drawn)
D69  D1250-5R5C  [esd0402]  (value not drawn)
D70  D1250-5R5C  [esd0402]  (value not drawn)
D71  D1250-5R5C  [esd0402]  (value not drawn)
D72  D1250-5R5C  [esd0402]  (value not drawn)
D73  D1250-5R5C  [esd0402]  (value not drawn)
J17  HDMI-001C  [HDMI-SMD]
Q15  2SK3018  [SOT23]
Q16  2SK3018  [SOT23]
Q17  2SK3018  [SOT23]
Q18  2SK3018  [SOT23]
Q19  2SK3018  [SOT23]
Q20  2SK3018  [SOT23]
Q21  2SK3018  [SOT23]
Q22  2SK3018  [SOT23]
Q23  2SK3018  [SOT23]
R172  4.7K  [R0402]
R173  10K  [R0402]
R174  1K  [R0402]
R175  4.7K  [R0402]
R176  10K  [R0402]
R177  0R  [R0402]
R178  47K  [R0402]
R179  47K  [R0402]
R180  1.2K  [R0402]
R181  47K  [R0402]
R182  499R  [R0402]
R183  499R  [R0402]
R184  499R  [R0402]
R185  499R  [R0402]
R186  499R  [R0402]
R187  499R  [R0402]
R188  499R  [R0402]
R189  499R  [R0402]
R190  1K  [R0402]
R191  27K  [R0402]
R192  10K  [R0402]
R354  27K  [R0402]

### Nets
CORE_VCC_1V8_S0: Q15.1(GATE) Q23.1(GATE) R172.1 R174.1 R175.1 R191.1
GND: C153.2 D34.1 D35.1 D36.1 D37.1 D38.1 D39.1 D66.1 D67.1 D68.1 D69.1 D70.1 D71.1 D72.1 D73.1 J17.2 J17.5 J17.8 J17.11 J17.17 Q17.2(SOURCE) Q18.2(SOURCE) Q19.2(SOURCE) Q20.2(SOURCE) Q21.2(SOURCE) Q22.2(SOURCE) R177.2 R181.2 R192.2
HDMI1_5V: C153.1 D33.1 D39.2 J17.18 R173.1 R176.1
VCC_3V3_S0: D49.2 R178.1 R179.1
VCC_5V0_S0: D33.2
HDMI1_eARC+: C151.2 D37.2 J17.14
HDMI1_eARC-: C152.2 D34.2 J17.19 R180.2
HDMI1_TX_ON: R190.1 ; off-sheet HDMI1_TX_ON  [project net GPIO1_A7]
HDMI_TX1_CEC_M0: Q23.2(SOURCE) R191.2 ; off-sheet HDMI_TX1_CEC_M0
HDMI_TX1_CEC_PORT: D38.2 J17.13 Q23.3(DRAIN) R354.2
HDMI_TX1_D0N: C148.1 ; off-sheet HDMI_TX1_D0N
HDMI_TX1_D0N_PORT: C148.2 D68.2 J17.9 R188.1
HDMI_TX1_D0P: C147.1 ; off-sheet HDMI_TX1_D0P
HDMI_TX1_D0P_PORT: C147.2 D69.2 J17.7 R189.1
HDMI_TX1_D1N: C146.1 ; off-sheet HDMI_TX1_D1N
HDMI_TX1_D1N_PORT: C146.2 D70.2 J17.6 R186.1
HDMI_TX1_D1P: C145.1 ; off-sheet HDMI_TX1_D1P
HDMI_TX1_D1P_PORT: C145.2 D71.2 J17.4 R187.1
HDMI_TX1_D2N: C144.1 ; off-sheet HDMI_TX1_D2N
HDMI_TX1_D2N_PORT: C144.2 D72.2 J17.3 R184.1
HDMI_TX1_D2P: C143.1 ; off-sheet HDMI_TX1_D2P
HDMI_TX1_D2P_PORT: C143.2 D73.2 J17.1 R185.1
HDMI_TX1_D3N: C150.1 ; off-sheet HDMI_TX1_D3N
HDMI_TX1_D3N_PORT: C150.2 D66.2 J17.12 R182.1
HDMI_TX1_D3P: C149.1 ; off-sheet HDMI_TX1_D3P
HDMI_TX1_D3P_PORT: C149.2 D67.2 J17.10 R183.1
HDMI_TX1_HPD_M0: Q17.3(DRAIN) R178.2 ; off-sheet HDMI_TX1_HPD_M0
HDMI_TX1_SBDN: C152.1 ; off-sheet HDMI_TX1_SBDN
HDMI_TX1_SBDP: C151.1 ; off-sheet HDMI_TX1_SBDP
HDMI_TX1_SCL_M0: Q15.2(SOURCE) R172.2 ; off-sheet HDMI_TX1_SCL_M0
HDMI_TX1_SCL_PORT: D36.2 J17.15 Q15.3(DRAIN) R173.2
HDMI_TX1_SDA_M0: C154.2 Q16.2(SOURCE) R175.2 ; off-sheet HDMI_TX1_SDA_M0
HDMI_TX1_SDA_PORT: D35.2 J17.16 Q16.3(DRAIN) R176.2
NetC154_1: C154.1 Q16.1(GATE) R174.2
NetD49_1: D49.1 R354.1
NetJ17_G1: J17.G1 J17.G2 J17.G3 J17.G4 R177.1
NetQ17_1: Q17.1(GATE) Q18.3(DRAIN) R179.2
NetQ18_1: Q18.1(GATE) R180.1 R181.1
NetQ19_1: Q19.1(GATE) Q20.1(GATE) Q21.1(GATE) Q22.1(GATE) R190.2 R192.1
NetQ19_3: Q19.3(DRAIN) R182.2 R183.2
NetQ20_3: Q20.3(DRAIN) R184.2 R185.2
NetQ21_3: Q21.3(DRAIN) R186.2 R187.2
NetQ22_3: Q22.3(DRAIN) R188.2 R189.2

### Notes on the sheet
- HDMI2.1 TX1接口
- (near D73) D1250-5R5C*4
- GPIO1_A7
- (near D69) D1250-5R5C*4
- (in symbol HDMI-001C) TYPE A; D2P; G_D2; D2N; D1P; G_D1; D1N; D0P; G_D0; D0N; CLKP; G_CLK; CLKN; CEC; Utility; SCL; SDA; G_DDC; +5V; HPD; GND

### Library data of the parts
C143-C150 = CAP_NP: as C131-C138 on sheet 7.HDMI2; PCB Footprint: C0402
C151-C153 = CAP_NP: as C112 on sheet 6.音频_FAN_ADC_LED; PCB Footprint: C0402
C154 = CAP_NP: as C126 on sheet 6.音频_FAN_ADC_LED; PCB Footprint: C0402
D33 = DIODE_SCHTKY: CLASS: IC; 丝印: SL; 生命周期: 量产; 价格: 0.175675; 规格书: 1N5819W.pdf; 类别: 贴片肖特基二极管; 品牌: 台湾迪嘉; 条码: EBF29140016; 规格: 肖特基二极管 直流反向耐压40V 平均整流电流1A 正向压降0.6V@1A SOD-123; 规格编号: 1N5819W; PCB Footprint: SOD-123
D34-D38 = DIODE BI-DIR TRIG: as D5 on sheet 7.HDMI2; 规格编号: D1250-5R5C
D39 = DIODE BI-DIR TRIG: as D79 on sheet 6.音频_FAN_ADC_LED; PCB Footprint: esd0402; 规格编号: D2315-5R0B
D49 = DIODE_SCHTKY: as D26 on sheet 7.HDMI2; 规格编号: 1N5819W; PCB Footprint: SOD-123
D66-D73 = DIODE BI-DIR TRIG: PCB Footprint: R0201; 规格: 防静电保护ESD二极管 反向工作电压5.5V 击穿电压6V 钳位电压10.5V 结电容Cj 0.17pF; 条码: EBFCIS240604160037; 品牌: 千虹; 类别: 贴片ESD; 规格书: 千虹_D1250-5R5C.pdf; 生命周期: 量产; 备注: 应用于HDMI2.1; 规格编号: D1250-5R5C
J17 = HDMI-001C: as J16 on sheet 7.HDMI2; PCB Footprint: HDMI-SMD; 规格编号: HDMI-001C
Q15 Q16 Q18 = 2SK3018: as Q6 on sheet 7.HDMI2; PCB Footprint: SOT23; 规格编号: 2SK3018
Q17 Q19-Q23 = 2SK3018: as Q8 on sheet 7.HDMI2; 规格编号: 2SK3018; PCB Footprint: SOT23
R172 R175 = RES: as R128 on sheet 6.音频_FAN_ADC_LED; PCB Footprint: R0402
R173 R176 R192 = RES: as R121 on sheet 6.音频_FAN_ADC_LED; PCB Footprint: R0402
R174 = RES: as R133 on sheet 6.音频_FAN_ADC_LED; PCB Footprint: R0402
R177 = RES: as R134 on sheet 6.音频_FAN_ADC_LED; PCB Footprint: R0402
R178 R179 = RES: as R157 on sheet 7.HDMI2; PCB Footprint: R0402
R180 = RES: CLASS: DISCRETE; 价格: 0.001447; 规格书: 厚声-无铅厚膜电阻.pdf; 类别: 贴片电阻0402; 品牌: 厚声; 条码: EBFCIS221112112140; 规格编号: 0402WGF1201TCE; 规格: 贴片电阻1.2K 1% 1/16W 0402; 生命周期: 量产; PCB Footprint: R0402
R181 = RES: as R160 on sheet 7.HDMI2; PCB Footprint: R0402
R182 R184 R187 R189 = RES: as R161 on sheet 7.HDMI2; PCB Footprint: R0402
R183 R185 R186 R188 = RES: as R162 on sheet 7.HDMI2; PCB Footprint: R0402
R190 = RES: as R351 on sheet 6.音频_FAN_ADC_LED; PCB Footprint: R0402
R191 = RES: as R170 on sheet 7.HDMI2; PCB Footprint: R0402
R354 = RES: CLASS: DISCRETE; 规格: 贴片电阻27K 1% 1/16W 0402; 规格编号: AC0402FR-0727KL; 条码: EBF29070003; 品牌: 国巨; 类别: 贴片电阻0402; 规格书: YAGEO国巨厚膜无铅电阻.pdf; 价格: 0.007054; 生命周期: 量产; PCB Footprint: R0402

## Sheet 9.PCIE3.SchDoc
size 420 x 297 mm; SheetNumber: 9; SheetTotal: 13
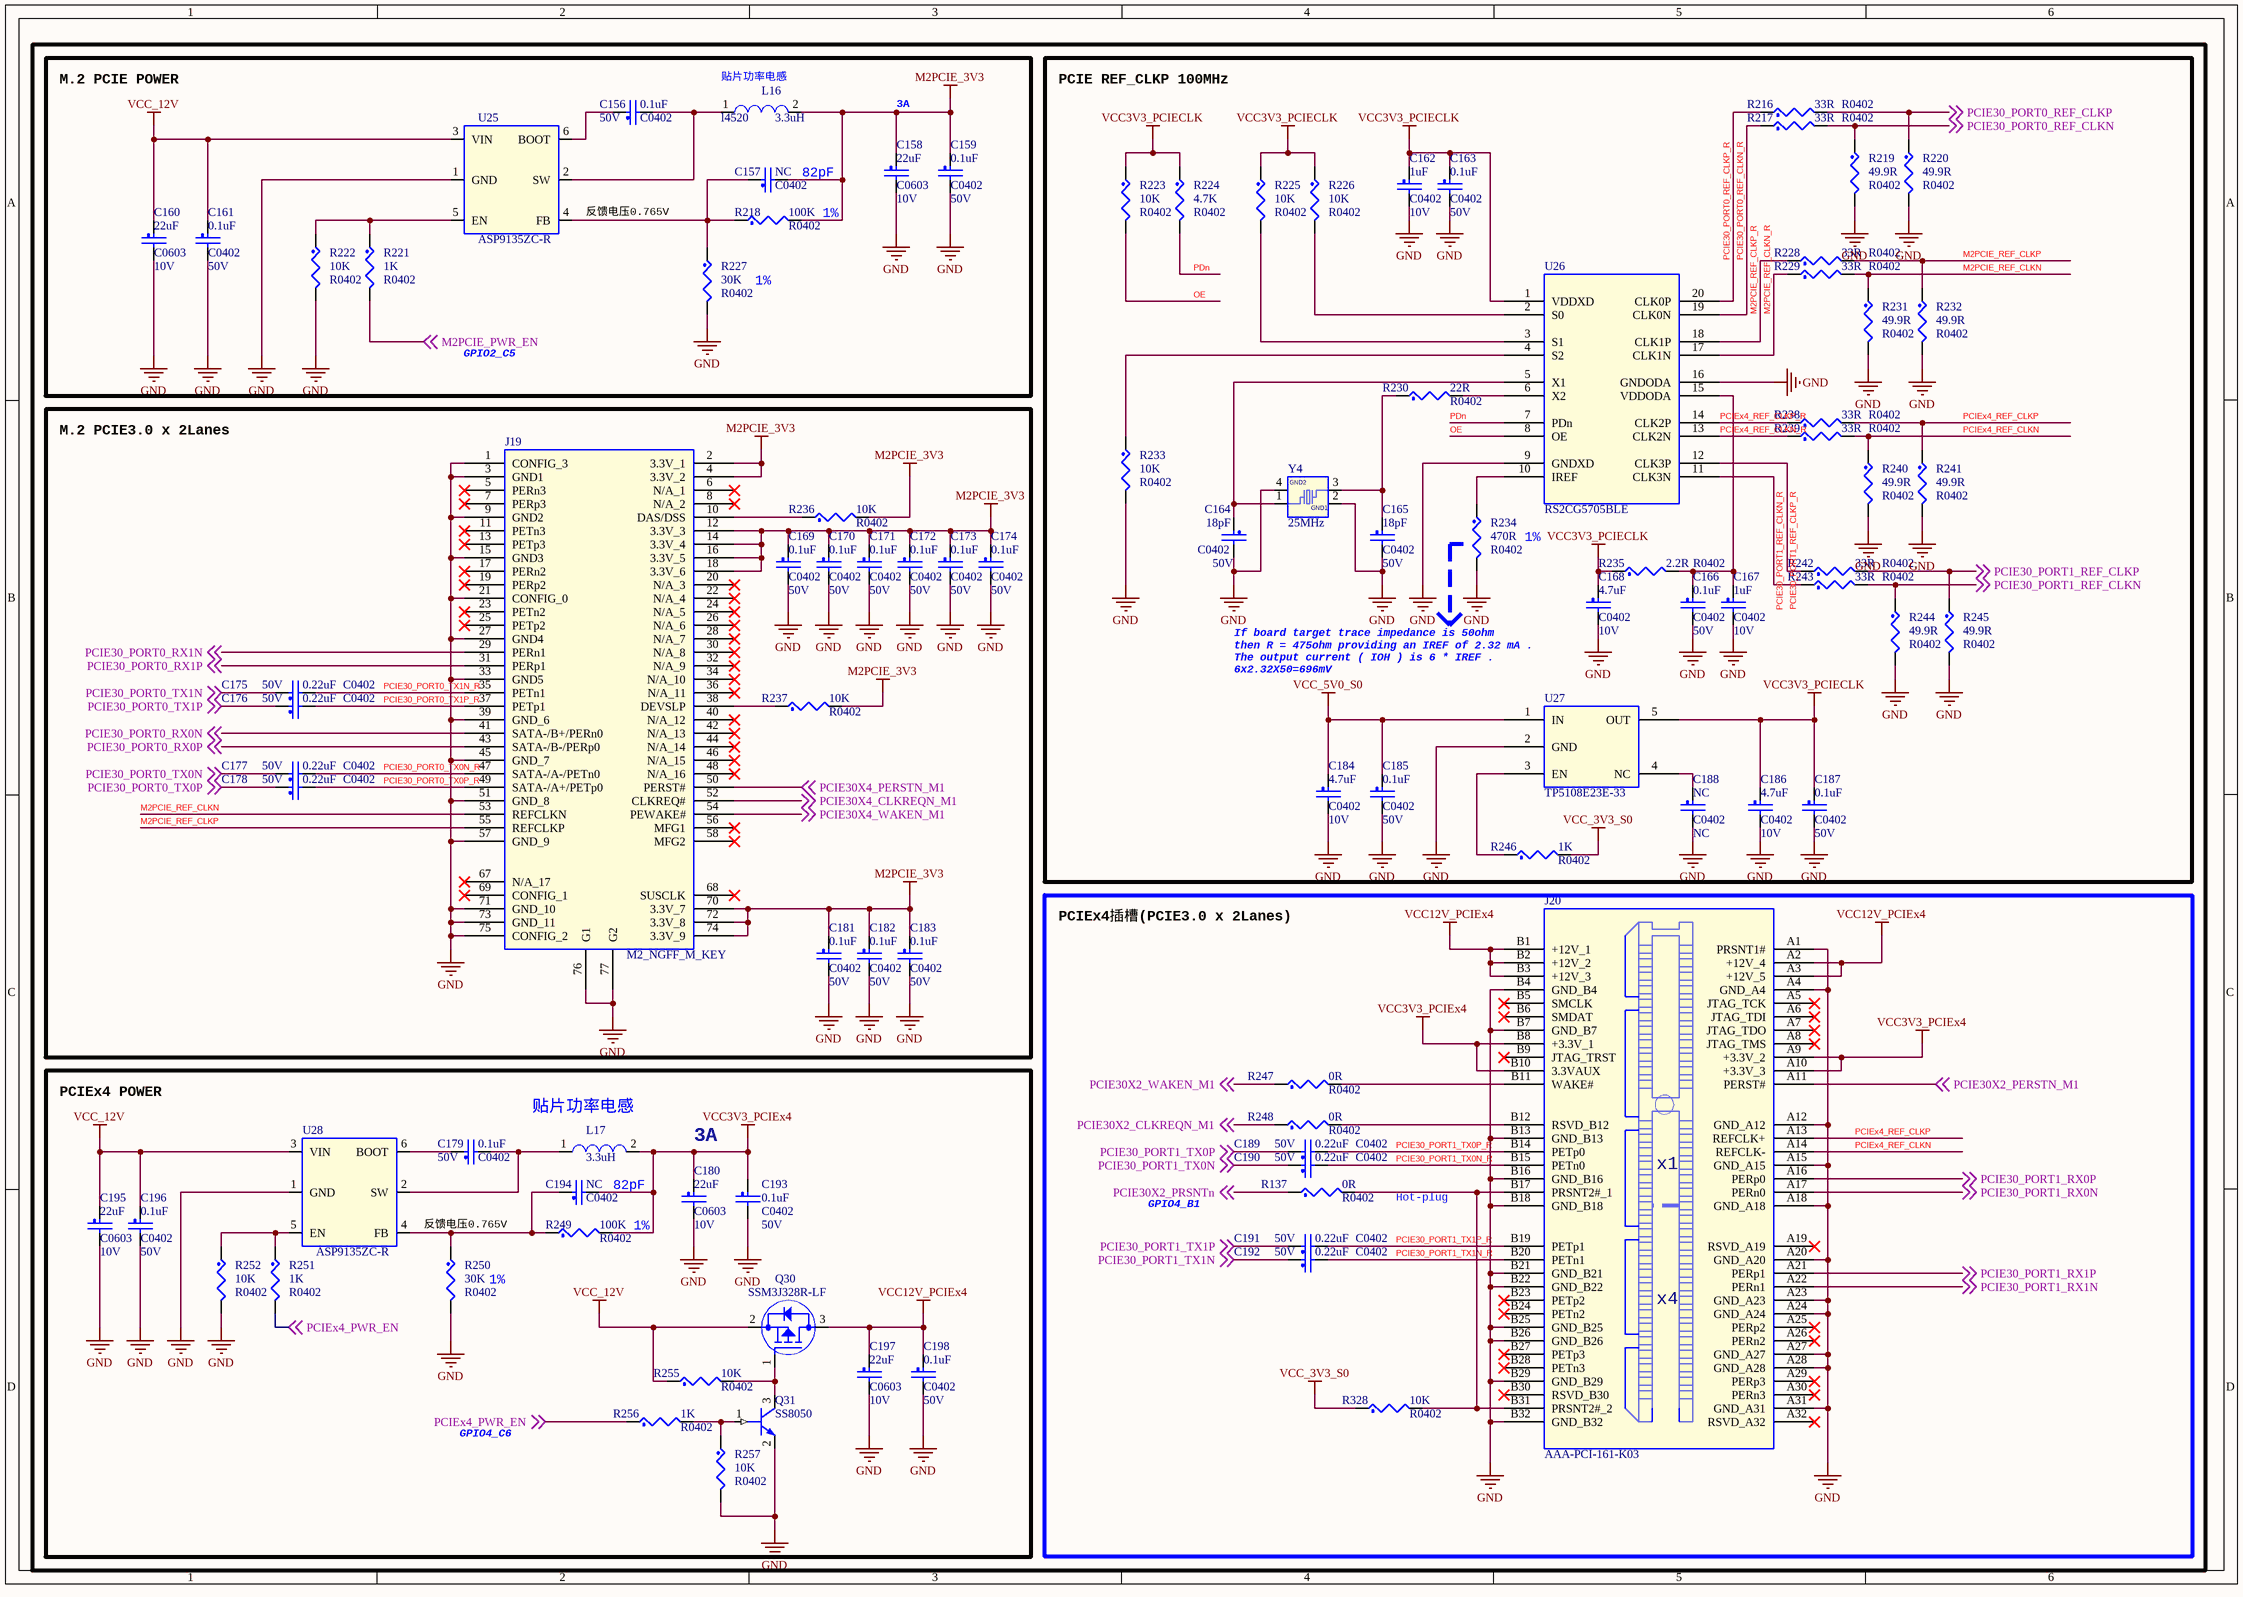
[diagram p8: 9.PCIE3.SchDoc]

### Parts
C156  0.1uF  Voltage: 50V  [C0402]
C157  NC  [C0402]
C158  22uF  Voltage: 10V  [C0603]
C159  0.1uF  Voltage: 50V  [C0402]
C160  22uF  Voltage: 10V  [C0603]
C161  0.1uF  Voltage: 50V  [C0402]
C162  1uF  Voltage: 10V  [C0402]
C163  0.1uF  Voltage: 50V  [C0402]
C164  18pF  Voltage: 50V  [C0402]
C165  18pF  Voltage: 50V  [C0402]
C166  0.1uF  Voltage: 50V  [C0402]
C167  1uF  Voltage: 10V  [C0402]
C168  4.7uF  Voltage: 10V  [C0402]
C169  0.1uF  Voltage: 50V  [C0402]
C170  0.1uF  Voltage: 50V  [C0402]
C171  0.1uF  Voltage: 50V  [C0402]
C172  0.1uF  Voltage: 50V  [C0402]
C173  0.1uF  Voltage: 50V  [C0402]
C174  0.1uF  Voltage: 50V  [C0402]
C175  0.22uF  Voltage: 50V  [C0402]
C176  0.22uF  Voltage: 50V  [C0402]
C177  0.22uF  Voltage: 50V  [C0402]
C178  0.22uF  Voltage: 50V  [C0402]
C179  0.1uF  Voltage: 50V  [C0402]
C180  22uF  Voltage: 10V  [C0603]
C181  0.1uF  Voltage: 50V  [C0402]
C182  0.1uF  Voltage: 50V  [C0402]
C183  0.1uF  Voltage: 50V  [C0402]
C184  4.7uF  Voltage: 10V  [C0402]
C185  0.1uF  Voltage: 50V  [C0402]
C186  4.7uF  Voltage: 10V  [C0402]
C187  0.1uF  Voltage: 50V  [C0402]
C188  NC  [C0402]
C189  0.22uF  Voltage: 50V  [C0402]
C190  0.22uF  Voltage: 50V  [C0402]
C191  0.22uF  Voltage: 50V  [C0402]
C192  0.22uF  Voltage: 50V  [C0402]
C193  0.1uF  Voltage: 50V  [C0402]
C194  NC  [C0402]
C195  22uF  Voltage: 10V  [C0603]
C196  0.1uF  Voltage: 50V  [C0402]
C197  22uF  Voltage: 10V  [C0603]
C198  0.1uF  Voltage: 50V  [C0402]
J19  M2_NGFF_M_KEY  [M2_NGFF_M_KEY]
J20  AAA-PCI-161-K03  [PCIE_64PIN_1R00]
L16  3.3uH  [l4520]
L17  3.3uH  [l4520]
Q30  SSM3J328R-LF  [SOT23]
Q31  SS8050  [SOT23]
R137  0R  [R0402]
R216  33R  [R0402]
R217  33R  [R0402]
R218  100K  [R0402]
R219  49.9R  [R0402]
R220  49.9R  [R0402]
R221  1K  [R0402]
R222  10K  [R0402]
R223  10K  [R0402]
R224  4.7K  [R0402]
R225  10K  [R0402]
R226  10K  [R0402]
R227  30K  [R0402]
R228  33R  [R0402]
R229  33R  [R0402]
R230  22R  [R0402]
R231  49.9R  [R0402]
R232  49.9R  [R0402]
R233  10K  [R0402]
R234  470R  [R0402]
R235  2.2R  [R0402]
R236  10K  [R0402]
R237  10K  [R0402]
R238  33R  [R0402]
R239  33R  [R0402]
R240  49.9R  [R0402]
R241  49.9R  [R0402]
R242  33R  [R0402]
R243  33R  [R0402]
R244  49.9R  [R0402]
R245  49.9R  [R0402]
R246  1K  [R0402]
R247  0R  [R0402]
R248  0R  [R0402]
R249  100K  [R0402]
R250  30K  [R0402]
R251  1K  [R0402]
R252  10K  [R0402]
R255  10K  [R0402]
R256  1K  [R0402]
R257  10K  [R0402]
R328  10K  [R0402]
U25  ASP9135ZC-R  [SOT23_6]
U26  RS2CG5705BLE  [TSSOP20]
U27  TP5108E23E-33  [SOT23-5]
U28  ASP9135ZC-R  [SOT23_6]
Y4  25MHz  [3225]

### Blocks framed on the sheet
M.2 PCIE POWER: C156-C161 L16 R218 R221 R222 R227 U25
PCIE REF_CLKP 100MHz: C162-C168 C184-C188 R216 R217 R219 R220 R223-R226 R228-R235 R238-R246 U26 U27 Y4
M.2 PCIE3.0 x 2Lanes: C169-C178 C181-C183 J19 R236 R237
PCIEx4插槽(PCIE3.0 x 2Lanes): C189-C192 J20 R137 R247 R248 R328
3A: C179 C180 C193-C198 L17 Q30 Q31 R249-R252 R255-R257 U28

### Nets
GND: C158.2 C159.2 C160.2 C161.2 C162.2 C163.2 C164.2 C165.2 C166.2 C167.2 C168.2 C169.2 C170.2 C171.2 C172.2 C173.2 C174.2 C180.2 C181.2 C182.2 C183.2 C184.2 C185.2 C186.2 C187.2 C188.2 C193.2 C195.2 C196.2 C197.2 C198.2 J19.1(CONFIG_3) J19.3(GND1) J19.9(GND2) J19.15(GND3) J19.21(CONFIG_0) J19.27(GND4) J19.33(GND5) J19.39(GND_6) J19.45(GND_7) J19.51(GND_8) J19.57(GND_9) J19.71(GND_10) J19.73(GND_11) J19.75(CONFIG_2) J19.76(G1) J19.77(G2) J20.A1(PRSNT1#) J20.A4(GND_A4) J20.A12(GND_A12) J20.A15(GND_A15) J20.A18(GND_A18) J20.A20(GND_A20) J20.A23(GND_A23) J20.A24(GND_A24) J20.A27(GND_A27) J20.A28(GND_A28) J20.A31(GND_A31) J20.B4(GND_B4) J20.B7(GND_B7) J20.B13(GND_B13) J20.B16(GND_B16) J20.B18(GND_B18) J20.B21(GND_B21) J20.B22(GND_B22) J20.B25(GND_B25) J20.B26(GND_B26) J20.B29(GND_B29) J20.B32(GND_B32) Q31.2(EMITTER) R219.2 R220.2 R222.2 R227.2 R231.2 R232.2 R233.2 R234.2 R240.2 R241.2 R244.2 R245.2 R250.2 R252.2 R257.2 U25.1(GND) U26.9(GNDXD) U26.16(GNDODA) U27.2(GND) U28.1(GND) Y4.2(GND1) Y4.4(GND2)
M2PCIE_3V3: C157.2 C158.1 C159.1 C169.1 C170.1 C171.1 C172.1 C173.1 C174.1 C181.1 C182.1 C183.1 J19.2(3.3V_1) J19.4(3.3V_2) J19.12(3.3V_3) J19.14(3.3V_4) J19.16(3.3V_5) J19.18(3.3V_6) J19.70(3.3V_7) J19.72(3.3V_8) J19.74(3.3V_9) L16.2 R218.2 R236.2 R237.2
VCC3V3_PCIECLK: C162.1 C163.1 C168.1 C186.1 C187.1 R223.1 R224.1 R225.1 R226.1 R235.1 U26.1(VDDXD) U27.5(OUT)
VCC3V3_PCIEx4: C180.1 C193.1 C194.2 J20.A9(+3.3V_2) J20.A10(+3.3V_3) J20.B8(+3.3V_1) J20.B10(3.3VAUX) L17.2 R249.2
VCC12V_PCIEx4: C197.1 C198.1 J20.A2(+12V_4) J20.A3(+12V_5) J20.B1(+12V_1) J20.B2(+12V_2) J20.B3(+12V_3) Q30.3(DRAIN)
VCC_3V3_S0: R246.2 R328.1
VCC_5V0_S0: C184.1 C185.1 U27.1(IN)
VCC_12V: C160.1 C161.1 C195.1 C196.1 Q30.2(SOURCE) R255.1 U25.3(VIN) U28.3(VIN)
M2PCIE_PWR_EN: R221.2 ; off-sheet M2PCIE_PWR_EN  [project net GPIO2_C5]
M2PCIE_REF_CLKN: J19.53(REFCLKN) R229.2 R231.1
M2PCIE_REF_CLKN_R: R229.1 U26.17(CLK1N)
M2PCIE_REF_CLKP: J19.55(REFCLKP) R228.2 R232.1
M2PCIE_REF_CLKP_R: R228.1 U26.18(CLK1P)
OE: R223.2 U26.8(OE)
PCIE30_PORT0_REF_CLKN: R217.2 R219.1 ; off-sheet PCIE30_PORT0_REF_CLKN
PCIE30_PORT0_REF_CLKN_R: R217.1 U26.19(CLK0N)
PCIE30_PORT0_REF_CLKP: R216.2 R220.1 ; off-sheet PCIE30_PORT0_REF_CLKP
PCIE30_PORT0_REF_CLKP_R: R216.1 U26.20(CLK0P)
PCIE30_PORT0_RX0N: J19.41(SATA-/B+/PERn0) ; off-sheet PCIE30_PORT0_RX0N
PCIE30_PORT0_RX0P: J19.43(SATA-/B-/PERp0) ; off-sheet PCIE30_PORT0_RX0P
PCIE30_PORT0_RX1N: J19.29(PERn1) ; off-sheet PCIE30_PORT0_RX1N
PCIE30_PORT0_RX1P: J19.31(PERp1) ; off-sheet PCIE30_PORT0_RX1P
PCIE30_PORT0_TX0N: C177.1 ; off-sheet PCIE30_PORT0_TX0N
PCIE30_PORT0_TX0N_R: C177.2 J19.47(SATA-/A-/PETn0)
PCIE30_PORT0_TX0P: C178.1 ; off-sheet PCIE30_PORT0_TX0P
PCIE30_PORT0_TX0P_R: C178.2 J19.49(SATA-/A+/PETp0)
PCIE30_PORT0_TX1N: C175.1 ; off-sheet PCIE30_PORT0_TX1N
PCIE30_PORT0_TX1N_R: C175.2 J19.35(PETn1)
PCIE30_PORT0_TX1P: C176.1 ; off-sheet PCIE30_PORT0_TX1P
PCIE30_PORT0_TX1P_R: C176.2 J19.37(PETp1)
PCIE30_PORT1_REF_CLKN: R243.2 R244.1 ; off-sheet PCIE30_PORT1_REF_CLKN
PCIE30_PORT1_REF_CLKN_R: R243.1 U26.11(CLK3N)
PCIE30_PORT1_REF_CLKP: R242.2 R245.1 ; off-sheet PCIE30_PORT1_REF_CLKP
PCIE30_PORT1_REF_CLKP_R: R242.1 U26.12(CLK3P)
PCIE30_PORT1_RX0N: J20.A17(PERn0) ; off-sheet PCIE30_PORT1_RX0N
PCIE30_PORT1_RX0P: J20.A16(PERp0) ; off-sheet PCIE30_PORT1_RX0P
PCIE30_PORT1_RX1N: J20.A22(PERn1) ; off-sheet PCIE30_PORT1_RX1N
PCIE30_PORT1_RX1P: J20.A21(PERp1) ; off-sheet PCIE30_PORT1_RX1P
PCIE30_PORT1_TX0N: C190.1 ; off-sheet PCIE30_PORT1_TX0N
PCIE30_PORT1_TX0N_R: C190.2 J20.B15(PETn0)
PCIE30_PORT1_TX0P: C189.1 ; off-sheet PCIE30_PORT1_TX0P
PCIE30_PORT1_TX0P_R: C189.2 J20.B14(PETp0)
PCIE30_PORT1_TX1N: C192.1 ; off-sheet PCIE30_PORT1_TX1N
PCIE30_PORT1_TX1N_R: C192.2 J20.B20(PETn1)
PCIE30_PORT1_TX1P: C191.1 ; off-sheet PCIE30_PORT1_TX1P
PCIE30_PORT1_TX1P_R: C191.2 J20.B19(PETp1)
PCIE30X2_CLKREQN_M1: R248.1 ; off-sheet PCIE30X2_CLKREQN_M1
PCIE30X2_PERSTN_M1: J20.A11(PERST#) ; off-sheet PCIE30X2_PERSTN_M1
PCIE30X2_PRSNTn: R137.1 ; off-sheet PCIE30X2_PRSNTn  [project net GPIO4_B1]
PCIE30X2_WAKEN_M1: R247.1 ; off-sheet PCIE30X2_WAKEN_M1
PCIE30X4_CLKREQN_M1: J19.52(CLKREQ#) ; off-sheet PCIE30X4_CLKREQN_M1
PCIE30X4_PERSTN_M1: J19.50(PERST#) ; off-sheet PCIE30X4_PERSTN_M1
PCIE30X4_WAKEN_M1: J19.54(PEWAKE#) ; off-sheet PCIE30X4_WAKEN_M1
PCIEx4_PWR_EN: R251.2 R256.1 ; off-sheet PCIEx4_PWR_EN  [project net GPIO4_C6]
PCIEx4_REF_CLKN: J20.A14(REFCLK-) R239.2 R240.1
PCIEx4_REF_CLKN_R: R239.1 U26.13(CLK2N)
PCIEx4_REF_CLKP: J20.A13(REFCLK+) R238.2 R241.1
PCIEx4_REF_CLKP_R: R238.1 U26.14(CLK2P)
PDn: R224.2 U26.7(PDn)
NetC156_1: C156.1 U25.6(BOOT)
NetC156_2: C156.2 L16.1 U25.2(SW)
NetC157_1: C157.1 R218.1 R227.1 U25.4(FB)
NetC164_1: C164.1 U26.5(X1) Y4.1
NetC165_1: C165.1 R230.1 Y4.3
NetC166_1: C166.1 C167.1 R235.2 U26.15(VDDODA)
NetC179_1: C179.1 U28.6(BOOT)
NetC179_2: C179.2 L17.1 U28.2(SW)
NetC188_1: C188.1 U27.4(NC)
NetC194_1: C194.1 R249.1 R250.1 U28.4(FB)
NetJ19_10: J19.10(DAS/DSS) R236.1
NetJ19_38: J19.38(DEVSLP) R237.1
NetJ20_B11: J20.B11(WAKE#) R247.2
NetJ20_B12: J20.B12(RSVD_B12) R248.2
NetJ20_B17: J20.B17(PRSNT2#_1) J20.B31(PRSNT2#_2) R137.2 R328.2
NetQ30_1: Q30.1(GATE) Q31.3(COLLECTOR) R255.2
NetQ31_1: Q31.1(BASE) R256.2 R257.1
NetR221_1: R221.1 R222.1 U25.5(EN)
NetR225_2: R225.2 U26.3(S1)
NetR226_2: R226.2 U26.2(S0)
NetR230_2: R230.2 U26.6(X2)
NetR233_1: R233.1 U26.4(S2)
NetR234_1: R234.1 U26.10(IREF)
NetR246_1: R246.1 U27.3(EN)
NetR251_1: R251.1 R252.1 U28.5(EN)

Not connected (* = marked no-connect by the designer): J19 5(PERn3)* 6(N/A_1)* 7(PERp3)* 8(N/A_2)* 11(PETn3)* 13(PETp3)* 17(PERn2)* 19(PERp2)* 20(N/A_3)* 22(N/A_4)* 23(PETn2)* 24(N/A_5)* 25(PETp2)* 26(N/A_6)* 28(N/A_7)* 30(N/A_8)* 32(N/A_9)* 34(N/A_10)* 36(N/A_11)* 40(N/A_12)* 42(N/A_13)* 44(N/A_14)* 46(N/A_15)* 48(N/A_16)* 56(MFG1)* 58(MFG2)* 67(N/A_17)* 68(SUSCLK)* 69(CONFIG_1)*; J20 A5(JTAG_TCK)* A6(JTAG_TDI)* A7(JTAG_TDO)* A8(JTAG_TMS)* A19(RSVD_A19)* A25(PERp2)* A26(PERn2)* A29(PERp3)* A30(PERn3)* A32(RSVD_A32)* B5(SMCLK)* B6(SMDAT)* B9(JTAG_TRST)* B23(PETp2)* B24(PETn2)* B27(PETp3)* B28(PETn3)* B30(RSVD_B30)*

### Notes on the sheet
- (near L16) 贴片功率电感
- 3A
- 82pF
- (near U25) 反馈电压0.765V
- 1%
- GPIO2_C5
- If board target trace impedance is 50ohm
  then R = 475ohm providing an IREF of 2.32 mA .
  The output current ( IOH ) is 6 * IREF .
  6x2.32X50=696mV
- PCIEx4 POWER
- (near L17) 贴片功率电感
- GPIO4_B1
- Hot-plug
- 反馈电压0.765V
- (near R250) 1%
- GPIO4_C6
- (in symbol PCIEX4_64P) x1; x4

### Library data of the parts
C156 C159 C161 C166 C181-C183 C187 C193 C196 = CAP_NP: as C106 on sheet 6.音频_FAN_ADC_LED; PCB Footprint: C0402
C157 C188 = CAP_NP: CLASS: DISCRETE; 类别: 贴片电容0402; 条码: EBF29060149; 规格: 贴片电容NC 预留; Voltage: NC; PCB Footprint: C0402
C158 C180 C195 = CAP_NP: CLASS: DISCRETE; 生命周期: 量产; 价格: 0.078818; 规格书: 三星电容.pdf; 类别: 贴片电容0603; 品牌: 三星; 条码: EBF29060163; 规格编号: CL10A226MP8NUNE; 规格: 贴片电容22uF 20% 10V X5R 0603; PCB Footprint: C0603
C160 C197 = CAP_NP: CLASS: DISCRETE; 规格: 贴片电容22uF 20% 10V X5R 0603; 规格编号: CL10A226MP8NUNE; 条码: EBF29060163; 品牌: 三星; 类别: 贴片电容0603; 规格书: 三星电容.pdf; 价格: 0.078818; 生命周期: 量产; PCB Footprint: C0603
C162 = CAP_NP: as C302 on sheet 6.音频_FAN_ADC_LED; PCB Footprint: C0402
C163 C169-C174 C179 C185 C198 = CAP_NP: as C278 on sheet 6.音频_FAN_ADC_LED; PCB Footprint: C0402
C164 = CAP_NP: CLASS: DISCRETE; 生命周期: 量产; 价格: 0.00515; 规格书: 风华电容.pdf; 类别: 贴片电容0402; 品牌: 风华; 条码: EBF29060235; 规格编号: 0402CG180J500NT; 规格: 贴片电容18pF 5% 50V C0G 0402; PCB Footprint: C0402
C165 = CAP_NP: CLASS: DISCRETE; 规格: 贴片电容18pF 5% 50V C0G 0402; 规格编号: 0402CG180J500NT; 条码: EBF29060235; 品牌: 风华; 类别: 贴片电容0402; 规格书: 风华电容.pdf; 价格: 0.00515; 生命周期: 量产; PCB Footprint: C0402
C167 = CAP_NP: as C112 on sheet 6.音频_FAN_ADC_LED; PCB Footprint: C0402
C168 C186 = CAP_NP: as C125 on sheet 6.音频_FAN_ADC_LED; PCB Footprint: C0402
C175-C178 = CAP_NP: as C131-C138 on sheet 7.HDMI2; PCB Footprint: C0402
C184 = CAP_NP: as C107 on sheet 6.音频_FAN_ADC_LED; PCB Footprint: C0402
C189-C192 = CAP_NP: CLASS: DISCRETE; 规格: 贴片电容0.22uF 20% 50V X5R 0402; 规格编号: UMK105BJ224MV-F; 条码: EBF29060266; 品牌: 太诱; 类别: 贴片电容0402; 规格书: 太诱-贴片电容.pdf; 价格: 0.074942; 生命周期: 量产; PCB Footprint: C0402
C194 = CAP_NP: as C121 on sheet 6.音频_FAN_ADC_LED; Voltage: NC; PCB Footprint: C0402
J19 = M2_NGFF_M_KEY: 规格: M.2NGFF高度5.5MMM.2连接器镀金30UMKEY67PIN; 条码: EBF29040083; 类别: 金手指连接器; 规格书: M.2NGFF-M-67PIN.pdf; 生命周期: 量产; PCB Footprint: M2_NGFF_M_KEY; 规格编号: M2_NGFF_M_KEY
J20 = PCIEX4_64P: 备注: RK3588 BTB底板; 生命周期: 量产; 规格书: 嘉澤端子_AAA-PCI-161-K03.pdf; 类别: 金手指连接器; 品牌: 嘉澤端子; 条码: EBFCIS230725213659; 规格: PCIEX4连接器 64P 插件; 规格编号: AAA-PCI-161-K03; PCB Footprint: PCIE_64PIN_1R00
L16 L17 = IND: CLASS: DISCRETE; 规格: 贴片电感3.3uH ±20% 3A 直流电阻69mΩ; 条码: EBF29050040; 品牌: 台庆; 类别: 贴片电感0402; 规格书: 台庆-功率电感.pdf; 生命周期: 量产; 规格编号: TMPC0402HP-3R3MG-Z02; 价格: 1.5992; PCB Footprint: l4520
Q30 = MOSFET_P: as Q1 on sheet 6.音频_FAN_ADC_LED; PCB Footprint: SOT23
Q31 = NPN: as Q2 on sheet 6.音频_FAN_ADC_LED; PCB Footprint: SOT23; 规格编号: SS8050
R137 R247 R248 = RES: as R134 on sheet 6.音频_FAN_ADC_LED; PCB Footprint: R0402
R216 R217 R228 R229 R242 R243 = RES: CLASS: DISCRETE; 生命周期: 量产; 价格: 0.002158; 规格书: 厚声-无铅厚膜电阻.pdf; 类别: 贴片电阻0402; 品牌: 厚声; 条码: EBF29070187; 规格编号: 0402WGF330JTCE; 规格: 贴片电阻33R 1% 1/16W 0402; PCB Footprint: R0402
R218 = RES: as R116 on sheet 6.音频_FAN_ADC_LED; PCB Footprint: R0402
R219 R220 R240 R241 R244 R245 = RES: CLASS: DISCRETE; 生命周期: 量产; 价格: 0.002703; 规格书: 厚声-无铅厚膜电阻.pdf; 类别: 贴片电阻0402; 品牌: 厚声; 条码: EBF29070059; 规格编号: 0402WGF499JTCE; 规格: 贴片电阻49.9R 1% 1/16W 0402; PCB Footprint: R0402
R221 R251 = RES: as R351 on sheet 6.音频_FAN_ADC_LED; PCB Footprint: R0402
R222 R223 R225 R226 R233 R236 R237 R252 = RES: as R121 on sheet 6.音频_FAN_ADC_LED; PCB Footprint: R0402
R224 = RES: CLASS: DISCRETE; 规格: 贴片电阻4.7K 1% 1/16W 0402; 规格编号: RI0402L4701FT; 条码: EBF29070047; 品牌: 合科泰; 类别: 贴片电阻0402; 规格书: 合科泰-RI系列电阻.pdf; 生命周期: 量产; PCB Footprint: R0402
R227 = RES: CLASS: DISCRETE; 生命周期: 量产; 规格书: 合科泰-RI系列电阻.pdf; 类别: 贴片电阻0402; 品牌: 合科泰; 条码: EBF29070048; 规格编号: RI0402L3002FT; 规格: 贴片电阻30K 1% 1/16W 0402; PCB Footprint: R0402
R230 = RES: CLASS: DISCRETE; 规格: 贴片电阻22R 1% 1/16W 0402; 规格编号: RI0402L22R0FT; 条码: EBF29070181; 品牌: 合科泰; 类别: 贴片电阻0402; 规格书: 合科泰-RI系列电阻.pdf; 生命周期: 量产; PCB Footprint: R0402
R231 R232 = RES: CLASS: DISCRETE; 规格: 贴片电阻49.9R 1% 1/16W 0402; 规格编号: 0402WGF499JTCE; 条码: EBF29070059; 品牌: 厚声; 类别: 贴片电阻0402; 规格书: 厚声-无铅厚膜电阻.pdf; 价格: 0.002703; 生命周期: 量产; PCB Footprint: R0402
R234 = RES: CLASS: DISCRETE; 生命周期: 量产; 价格: 0.002728; 规格书: 厚声-无铅厚膜电阻.pdf; 类别: 贴片电阻0402; 品牌: 厚声; 条码: EBF29070284; 规格编号: 0402WGF4700TCE; 规格: 贴片电阻470R 1% 1/16W 0402; PCB Footprint: R0402
R235 = RES: CLASS: DISCRETE; 规格: 贴片电阻2.2R 1% 1/16W 0402; 规格编号: 0402WGF220KTCE; 条码: EBF29070280; 品牌: 厚声; 类别: 贴片电阻0402; 规格书: 厚声-无铅厚膜电阻.pdf; 价格: 0.003072; 生命周期: 量产; PCB Footprint: R0402
R238 R239 = RES: CLASS: DISCRETE; 规格: 贴片电阻33R 1% 1/16W 0402; 规格编号: 0402WGF330JTCE; 条码: EBF29070187; 品牌: 厚声; 类别: 贴片电阻0402; 规格书: 厚声-无铅厚膜电阻.pdf; 价格: 0.002158; 生命周期: 量产; PCB Footprint: R0402
R246 R256 = RES: as R133 on sheet 6.音频_FAN_ADC_LED; PCB Footprint: R0402
R249 = RES: as R119 on sheet 6.音频_FAN_ADC_LED; PCB Footprint: R0402
R250 = RES: CLASS: DISCRETE; 规格: 贴片电阻30K 1% 1/16W 0402; 规格编号: RI0402L3002FT; 条码: EBF29070048; 品牌: 合科泰; 类别: 贴片电阻0402; 规格书: 合科泰-RI系列电阻.pdf; 生命周期: 量产; PCB Footprint: R0402
R255 R257 R328 = RES: as R132 on sheet 6.音频_FAN_ADC_LED; PCB Footprint: R0402
U25 = TP6327GS6: 生命周期: 量产; 规格书: 安森德_ASP9135ZC-R.pdf; 类别: 电源管理-DCDC; 品牌: 安森德; 条码: EBFCIS240710113940; 规格: DC-DC电源芯片 可输出电流 3A 开关工作频率 600kHz 输出类型 ADJ 输入电压范围：4V-18V; 备注: RK3566金手指与BTB底板替换物料; PCB Footprint: SOT23_6; 规格编号: ASP9135ZC-R; 可替代料: TP6327GS6
U26 = PI6C557-05BLE: 备注: 通用; 生命周期: 量产; 规格书: 锐星微_RS2CG5705BLE.pdf; 类别: 时钟信号发生器; 品牌: 锐星微; 条码: EBFCIS240814173115; 规格: PCIe Gen 3 时钟发生器 输出通道：4通道 工作电压3.0~3.6V 输入频率：25MHz 最大输出频率：200MHz; PCB Footprint: tssop20; 规格编号: RS2CG5705BLE
U27 = LDO_PT5108: 规格: 低压差LDO 最高7V 输出3.3V 最大电流500mA 压差300mV@(200mA) 低噪声 高PSRR; 条码: EBF29110067; 品牌: 台舟; 类别: 电源管理-LDO; 规格书: 台舟TP5108E.pdf; 价格: 0.48864; 生命周期: 量产; PCB Footprint: SOT23-5; 规格编号: TP5108E23E-33
U28 = TP6327GS6: 规格: DC-DC电源芯片 可输出电流 3A 开关工作频率 600kHz 输出类型 ADJ 输入电压范围：4V-18V; 条码: EBFCIS240710113940; 品牌: 安森德; 类别: 电源管理-DCDC; 规格书: 安森德_ASP9135ZC-R.pdf; 生命周期: 量产; 备注: RK3566金手指与BTB底板替换物料; PCB Footprint: SOT23_6; 规格编号: ASP9135ZC-R; 可替代料: TP6327GS6
Y4 = CRYSTAL_4P: CLASS: IC; 规格: 无源晶振25MHZ 50Ω 16pF 3225; 规格编号: X322525MQB4SI; 条码: EBF29100005; 品牌: 扬兴科技; 类别: 贴片晶振 3225; 规格书: 扬兴科技-25MHZ.pdf; 价格: 0.385846; 生命周期: 量产; PCB Footprint: 3225